# EAGLE schematic RU-PCBA-2X2-001-03 (EAGLE 9.7.0), part 5 of 5
## Sheet 13 of 17: Row 13
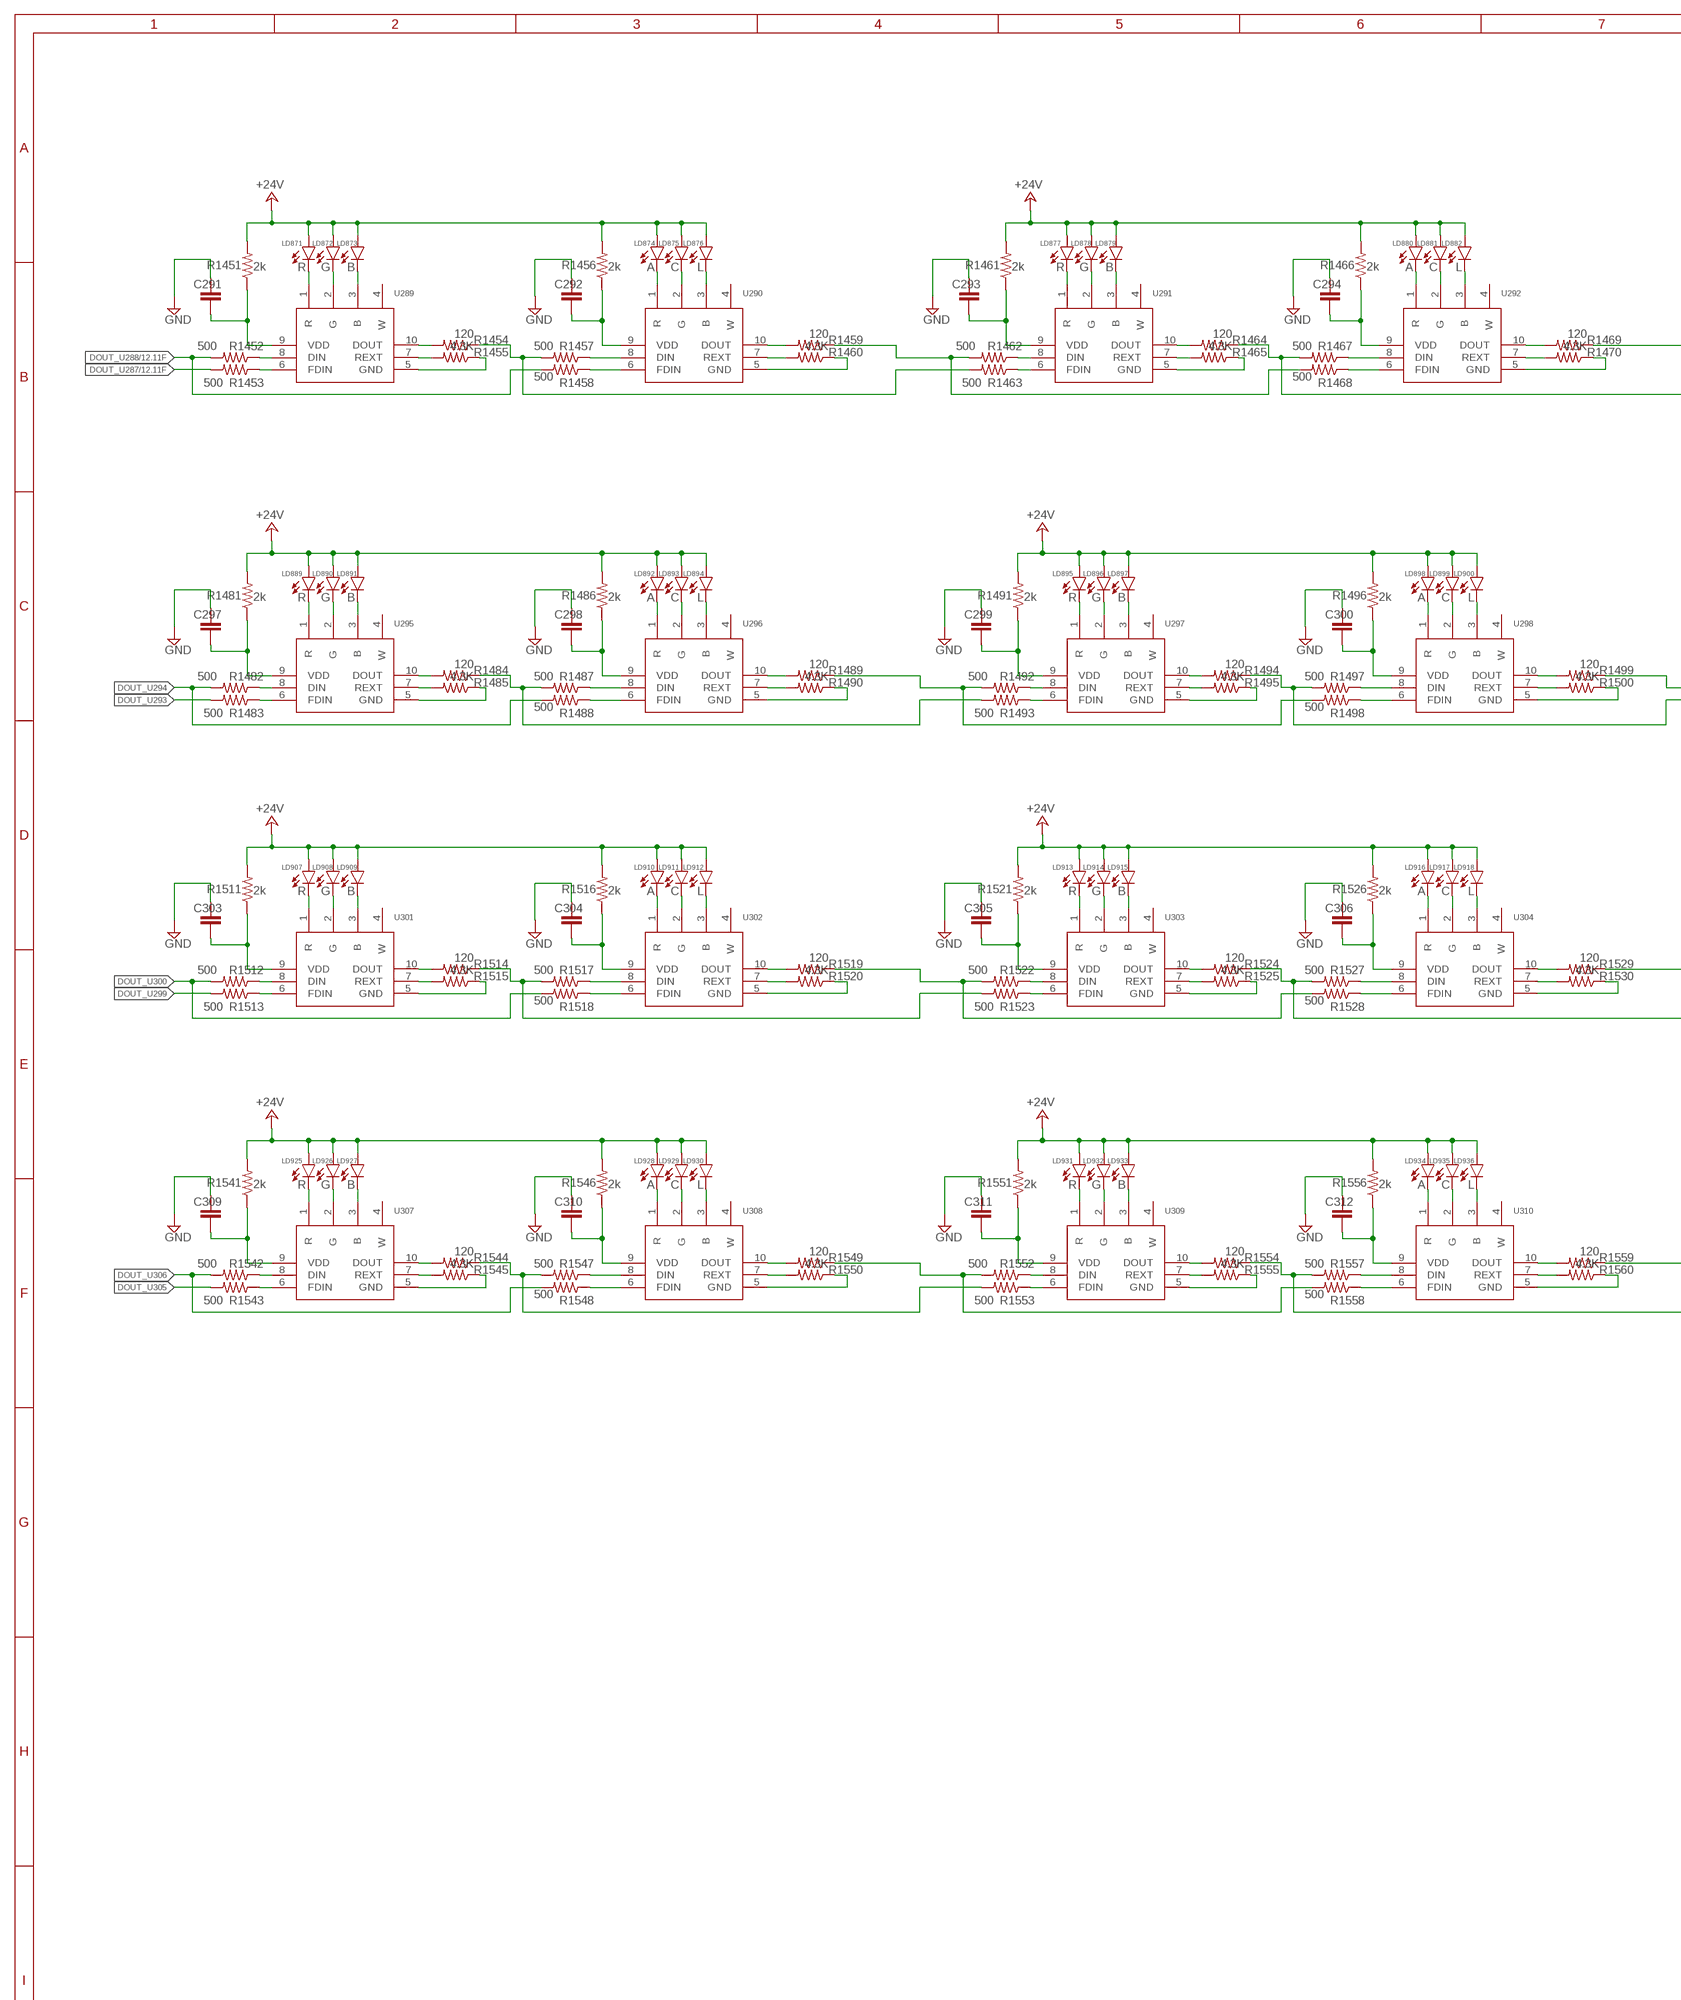
[diagram p24: schematic, sheet 13, part 1 of 2]
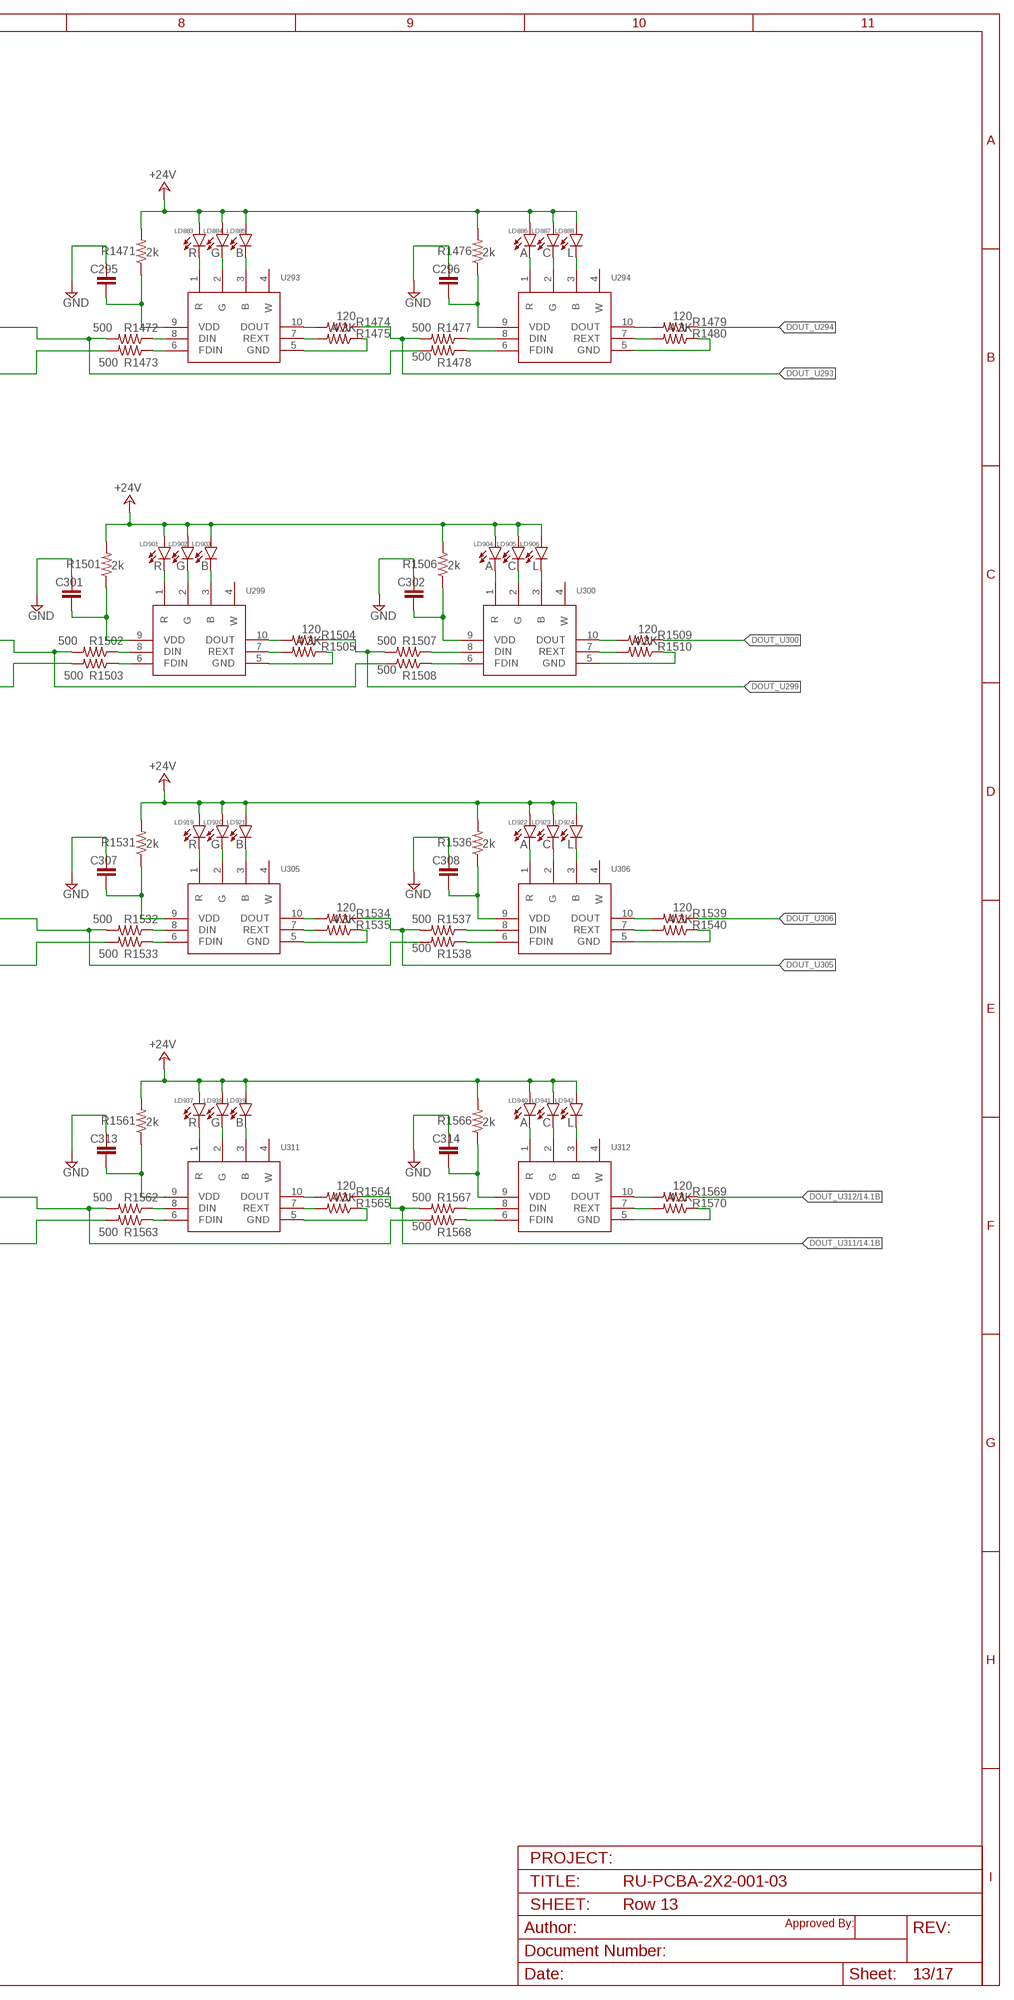
[diagram p25: schematic, sheet 13, part 2 of 2]

### Parts
C291  C-EUC1206  [C1206]
C292  C-EUC1206  [C1206]
C293  C-EUC1206  [C1206]
C294  C-EUC1206  [C1206]
C295  C-EUC1206  [C1206]
C296  C-EUC1206  [C1206]
C297  C-EUC1206  [C1206]
C298  C-EUC1206  [C1206]
C299  C-EUC1206  [C1206]
C300  C-EUC1206  [C1206]
C301  C-EUC1206  [C1206]
C302  C-EUC1206  [C1206]
C303  C-EUC1206  [C1206]
C304  C-EUC1206  [C1206]
C305  C-EUC1206  [C1206]
C306  C-EUC1206  [C1206]
C307  C-EUC1206  [C1206]
C308  C-EUC1206  [C1206]
C309  C-EUC1206  [C1206]
C310  C-EUC1206  [C1206]
C311  C-EUC1206  [C1206]
C312  C-EUC1206  [C1206]
C313  C-EUC1206  [C1206]
C314  C-EUC1206  [C1206]
LD871  R  5050LED  [5050LED]
LD872  G  5050LED  [5050LED]
LD873  B  5050LED  [5050LED]
LD874  A  5050LED  [5050LED]
LD875  C  5050LED  [5050LED]
LD876  L  5050LED  [5050LED]
LD877  R  5050LED  [5050LED]
LD878  G  5050LED  [5050LED]
LD879  B  5050LED  [5050LED]
LD880  A  5050LED  [5050LED]
LD881  C  5050LED  [5050LED]
LD882  L  5050LED  [5050LED]
LD883  R  5050LED  [5050LED]
LD884  G  5050LED  [5050LED]
LD885  B  5050LED  [5050LED]
LD886  A  5050LED  [5050LED]
LD887  C  5050LED  [5050LED]
LD888  L  5050LED  [5050LED]
LD889  R  5050LED  [5050LED]
LD890  G  5050LED  [5050LED]
LD891  B  5050LED  [5050LED]
LD892  A  5050LED  [5050LED]
LD893  C  5050LED  [5050LED]
LD894  L  5050LED  [5050LED]
LD895  R  5050LED  [5050LED]
LD896  G  5050LED  [5050LED]
LD897  B  5050LED  [5050LED]
LD898  A  5050LED  [5050LED]
LD899  C  5050LED  [5050LED]
LD900  L  5050LED  [5050LED]
LD901  R  5050LED  [5050LED]
LD902  G  5050LED  [5050LED]
LD903  B  5050LED  [5050LED]
LD904  A  5050LED  [5050LED]
LD905  C  5050LED  [5050LED]
LD906  L  5050LED  [5050LED]
LD907  R  5050LED  [5050LED]
LD908  G  5050LED  [5050LED]
LD909  B  5050LED  [5050LED]
LD910  A  5050LED  [5050LED]
LD911  C  5050LED  [5050LED]
LD912  L  5050LED  [5050LED]
LD913  R  5050LED  [5050LED]
LD914  G  5050LED  [5050LED]
LD915  B  5050LED  [5050LED]
LD916  A  5050LED  [5050LED]
LD917  C  5050LED  [5050LED]
LD918  L  5050LED  [5050LED]
LD919  R  5050LED  [5050LED]
LD920  G  5050LED  [5050LED]
LD921  B  5050LED  [5050LED]
LD922  A  5050LED  [5050LED]
LD923  C  5050LED  [5050LED]
LD924  L  5050LED  [5050LED]
LD925  R  5050LED  [5050LED]
LD926  G  5050LED  [5050LED]
LD927  B  5050LED  [5050LED]
LD928  A  5050LED  [5050LED]
LD929  C  5050LED  [5050LED]
LD930  L  5050LED  [5050LED]
LD931  R  5050LED  [5050LED]
LD932  G  5050LED  [5050LED]
LD933  B  5050LED  [5050LED]
LD934  A  5050LED  [5050LED]
LD935  C  5050LED  [5050LED]
LD936  L  5050LED  [5050LED]
LD937  R  5050LED  [5050LED]
LD938  G  5050LED  [5050LED]
LD939  B  5050LED  [5050LED]
LD940  A  5050LED  [5050LED]
LD941  C  5050LED  [5050LED]
LD942  L  5050LED  [5050LED]
R1451  2k  R-US_R1206  [R1206]
R1452  500  R-US_R0805  [R0805]
R1453  500  R-US_R0805  [R0805]
R1454  120  R-US_R0805  [R0805]
R1455  4.3K  R-US_R0805  [R0805]
R1456  2k  R-US_R1206  [R1206]
R1457  500  R-US_R0805  [R0805]
R1458  500  R-US_R0805  [R0805]
R1459  120  R-US_R0805  [R0805]
R1460  4.3K  R-US_R0805  [R0805]
R1461  2k  R-US_R1206  [R1206]
R1462  500  R-US_R0805  [R0805]
R1463  500  R-US_R0805  [R0805]
R1464  120  R-US_R0805  [R0805]
R1465  4.3K  R-US_R0805  [R0805]
R1466  2k  R-US_R1206  [R1206]
R1467  500  R-US_R0805  [R0805]
R1468  500  R-US_R0805  [R0805]
R1469  120  R-US_R0805  [R0805]
R1470  4.3K  R-US_R0805  [R0805]
R1471  2k  R-US_R1206  [R1206]
R1472  500  R-US_R0805  [R0805]
R1473  500  R-US_R0805  [R0805]
R1474  120  R-US_R0805  [R0805]
R1475  4.3K  R-US_R0805  [R0805]
R1476  2k  R-US_R1206  [R1206]
R1477  500  R-US_R0805  [R0805]
R1478  500  R-US_R0805  [R0805]
R1479  120  R-US_R0805  [R0805]
R1480  4.3K  R-US_R0805  [R0805]
R1481  2k  R-US_R1206  [R1206]
R1482  500  R-US_R0805  [R0805]
R1483  500  R-US_R0805  [R0805]
R1484  120  R-US_R0805  [R0805]
R1485  4.3K  R-US_R0805  [R0805]
R1486  2k  R-US_R1206  [R1206]
R1487  500  R-US_R0805  [R0805]
R1488  500  R-US_R0805  [R0805]
R1489  120  R-US_R0805  [R0805]
R1490  4.3K  R-US_R0805  [R0805]
R1491  2k  R-US_R1206  [R1206]
R1492  500  R-US_R0805  [R0805]
R1493  500  R-US_R0805  [R0805]
R1494  120  R-US_R0805  [R0805]
R1495  4.3K  R-US_R0805  [R0805]
R1496  2k  R-US_R1206  [R1206]
R1497  500  R-US_R0805  [R0805]
R1498  500  R-US_R0805  [R0805]
R1499  120  R-US_R0805  [R0805]
R1500  4.3K  R-US_R0805  [R0805]
R1501  2k  R-US_R1206  [R1206]
R1502  500  R-US_R0805  [R0805]
R1503  500  R-US_R0805  [R0805]
R1504  120  R-US_R0805  [R0805]
R1505  4.3K  R-US_R0805  [R0805]
R1506  2k  R-US_R1206  [R1206]
R1507  500  R-US_R0805  [R0805]
R1508  500  R-US_R0805  [R0805]
R1509  120  R-US_R0805  [R0805]
R1510  4.3K  R-US_R0805  [R0805]
R1511  2k  R-US_R1206  [R1206]
R1512  500  R-US_R0805  [R0805]
R1513  500  R-US_R0805  [R0805]
R1514  120  R-US_R0805  [R0805]
R1515  4.3K  R-US_R0805  [R0805]
R1516  2k  R-US_R1206  [R1206]
R1517  500  R-US_R0805  [R0805]
R1518  500  R-US_R0805  [R0805]
R1519  120  R-US_R0805  [R0805]
R1520  4.3K  R-US_R0805  [R0805]
R1521  2k  R-US_R1206  [R1206]
R1522  500  R-US_R0805  [R0805]
R1523  500  R-US_R0805  [R0805]
R1524  120  R-US_R0805  [R0805]
R1525  4.3K  R-US_R0805  [R0805]
R1526  2k  R-US_R1206  [R1206]
R1527  500  R-US_R0805  [R0805]
R1528  500  R-US_R0805  [R0805]
R1529  120  R-US_R0805  [R0805]
R1530  4.3K  R-US_R0805  [R0805]
R1531  2k  R-US_R1206  [R1206]
R1532  500  R-US_R0805  [R0805]
R1533  500  R-US_R0805  [R0805]
R1534  120  R-US_R0805  [R0805]
R1535  4.3K  R-US_R0805  [R0805]
R1536  2k  R-US_R1206  [R1206]
R1537  500  R-US_R0805  [R0805]
R1538  500  R-US_R0805  [R0805]
R1539  120  R-US_R0805  [R0805]
R1540  4.3K  R-US_R0805  [R0805]
R1541  2k  R-US_R1206  [R1206]
R1542  500  R-US_R0805  [R0805]
R1543  500  R-US_R0805  [R0805]
R1544  120  R-US_R0805  [R0805]
R1545  4.3K  R-US_R0805  [R0805]
R1546  2k  R-US_R1206  [R1206]
R1547  500  R-US_R0805  [R0805]
R1548  500  R-US_R0805  [R0805]
R1549  120  R-US_R0805  [R0805]
R1550  4.3K  R-US_R0805  [R0805]
R1551  2k  R-US_R1206  [R1206]
R1552  500  R-US_R0805  [R0805]
R1553  500  R-US_R0805  [R0805]
R1554  120  R-US_R0805  [R0805]
R1555  4.3K  R-US_R0805  [R0805]
R1556  2k  R-US_R1206  [R1206]
R1557  500  R-US_R0805  [R0805]
R1558  500  R-US_R0805  [R0805]
R1559  120  R-US_R0805  [R0805]
R1560  4.3K  R-US_R0805  [R0805]
R1561  2k  R-US_R1206  [R1206]
R1562  500  R-US_R0805  [R0805]
R1563  500  R-US_R0805  [R0805]
R1564  120  R-US_R0805  [R0805]
R1565  4.3K  R-US_R0805  [R0805]
R1566  2k  R-US_R1206  [R1206]
R1567  500  R-US_R0805  [R0805]
R1568  500  R-US_R0805  [R0805]
R1569  120  R-US_R0805  [R0805]
R1570  4.3K  R-US_R0805  [R0805]
U289  UCS7604  [SOP100P600X175-10N]
U290  UCS7604  [SOP100P600X175-10N]
U291  UCS7604  [SOP100P600X175-10N]
U292  UCS7604  [SOP100P600X175-10N]
U293  UCS7604  [SOP100P600X175-10N]
U294  UCS7604  [SOP100P600X175-10N]
U295  UCS7604  [SOP100P600X175-10N]
U296  UCS7604  [SOP100P600X175-10N]
U297  UCS7604  [SOP100P600X175-10N]
U298  UCS7604  [SOP100P600X175-10N]
U299  UCS7604  [SOP100P600X175-10N]
U300  UCS7604  [SOP100P600X175-10N]
U301  UCS7604  [SOP100P600X175-10N]
U302  UCS7604  [SOP100P600X175-10N]
U303  UCS7604  [SOP100P600X175-10N]
U304  UCS7604  [SOP100P600X175-10N]
U305  UCS7604  [SOP100P600X175-10N]
U306  UCS7604  [SOP100P600X175-10N]
U307  UCS7604  [SOP100P600X175-10N]
U308  UCS7604  [SOP100P600X175-10N]
U309  UCS7604  [SOP100P600X175-10N]
U310  UCS7604  [SOP100P600X175-10N]
U311  UCS7604  [SOP100P600X175-10N]
U312  UCS7604  [SOP100P600X175-10N]

### Nets
+24V: LD871.A LD872.A LD873.A LD874.A LD875.A LD876.A LD877.A LD878.A LD879.A LD880.A LD881.A LD882.A LD883.A LD884.A LD885.A LD886.A LD887.A LD888.A LD889.A LD890.A LD891.A LD892.A LD893.A LD894.A LD895.A LD896.A LD897.A LD898.A LD899.A LD900.A LD901.A LD902.A LD903.A LD904.A LD905.A LD906.A LD907.A LD908.A LD909.A LD910.A LD911.A LD912.A LD913.A LD914.A LD915.A LD916.A LD917.A LD918.A LD919.A LD920.A LD921.A LD922.A LD923.A LD924.A LD925.A LD926.A LD927.A LD928.A LD929.A LD930.A LD931.A LD932.A LD933.A LD934.A LD935.A LD936.A LD937.A LD938.A LD939.A LD940.A LD941.A LD942.A R1451.2 R1456.2 R1461.2 R1466.2 R1471.2 R1476.2 R1481.2 R1486.2 R1491.2 R1496.2 R1501.2 R1506.2 R1511.2 R1516.2 R1521.2 R1526.2 R1531.2 R1536.2 R1541.2 R1546.2 R1551.2 R1556.2 R1561.2 R1566.2 ; also sheet 1,2,3,4,5,6,7,8,9,10,11,12,14
DOUT_U287: R1453.2 ; also sheet 12
DOUT_U288: R1452.2 R1458.2 ; also sheet 12
DOUT_U293: R1474.1 R1477.2 R1483.2
DOUT_U294: R1479.1 R1482.2 R1488.2
DOUT_U299: R1504.1 R1507.2 R1513.2
DOUT_U300: R1509.1 R1512.2 R1518.2
DOUT_U305: R1534.1 R1537.2 R1543.2
DOUT_U306: R1539.1 R1542.2 R1548.2
DOUT_U311: R1564.1 R1567.2 ; also sheet 14
DOUT_U312: R1569.1 ; also sheet 14
GND: C291.2 C292.2 C293.2 C294.2 C295.2 C296.2 C297.2 C298.2 C299.2 C300.2 C301.2 C302.2 C303.2 C304.2 C305.2 C306.2 C307.2 C308.2 C309.2 C310.2 C311.2 C312.2 C313.2 C314.2 R1455.1 R1460.1 R1465.1 R1470.1 R1475.1 R1480.1 R1485.1 R1490.1 R1495.1 R1500.1 R1505.1 R1510.1 R1515.1 R1520.1 R1525.1 R1530.1 R1535.1 R1540.1 R1545.1 R1550.1 R1555.1 R1560.1 R1565.1 R1570.1 U289.5(GND) U290.5(GND) U291.5(GND) U292.5(GND) U293.5(GND) U294.5(GND) U295.5(GND) U296.5(GND) U297.5(GND) U298.5(GND) U299.5(GND) U300.5(GND) U301.5(GND) U302.5(GND) U303.5(GND) U304.5(GND) U305.5(GND) U306.5(GND) U307.5(GND) U308.5(GND) U309.5(GND) U310.5(GND) U311.5(GND) U312.5(GND) ; also sheet 1,2,3,4,5,6,7,8,9,10,11,12,14
N$2897: C291.1 R1451.1 U289.9(VDD)
N$2898: LD871.K(C) U289.1(R)
N$2899: LD872.K(C) U289.2(G)
N$2900: LD873.K(C) U289.3(B)
N$2901: R1452.1 U289.8(DIN)
N$2902: R1453.1 U289.6(FDIN)
N$2903: R1454.2 U289.10(DOUT)
N$2904: R1455.2 U289.7(REXT)
N$2905: LD874.K(C) U290.1(R)
N$2906: LD875.K(C) U290.2(G)
N$2907: LD876.K(C) U290.3(B)
N$2908: C292.1 R1456.1 U290.9(VDD)
N$2909: R1457.1 U290.8(DIN)
N$2910: R1454.1 R1457.2 R1463.2
N$2911: R1458.1 U290.6(FDIN)
N$2914: R1459.2 U290.10(DOUT)
N$2915: R1460.2 U290.7(REXT)
N$2916: R1459.1 R1462.2 R1468.2
N$2917: C293.1 R1461.1 U291.9(VDD)
N$2918: LD877.K(C) U291.1(R)
N$2919: LD878.K(C) U291.2(G)
N$2920: LD879.K(C) U291.3(B)
N$2921: R1462.1 U291.8(DIN)
N$2922: R1463.1 U291.6(FDIN)
N$2923: R1464.2 U291.10(DOUT)
N$2924: R1465.2 U291.7(REXT)
N$2925: LD880.K(C) U292.1(R)
N$2926: LD881.K(C) U292.2(G)
N$2927: LD882.K(C) U292.3(B)
N$2928: C294.1 R1466.1 U292.9(VDD)
N$2929: R1467.1 U292.8(DIN)
N$2930: R1464.1 R1467.2 R1473.2
N$2931: R1468.1 U292.6(FDIN)
N$2934: R1469.2 U292.10(DOUT)
N$2935: R1470.2 U292.7(REXT)
N$2936: R1469.1 R1472.2 R1478.2
N$2937: C295.1 R1471.1 U293.9(VDD)
N$2938: LD883.K(C) U293.1(R)
N$2939: LD884.K(C) U293.2(G)
N$2940: LD885.K(C) U293.3(B)
N$2941: R1472.1 U293.8(DIN)
N$2942: R1473.1 U293.6(FDIN)
N$2943: R1474.2 U293.10(DOUT)
N$2944: R1475.2 U293.7(REXT)
N$2945: LD886.K(C) U294.1(R)
N$2946: LD887.K(C) U294.2(G)
N$2947: LD888.K(C) U294.3(B)
N$2948: C296.1 R1476.1 U294.9(VDD)
N$2949: R1477.1 U294.8(DIN)
N$2951: R1478.1 U294.6(FDIN)
N$2954: R1479.2 U294.10(DOUT)
N$2955: R1480.2 U294.7(REXT)
N$2957: C297.1 R1481.1 U295.9(VDD)
N$2958: LD889.K(C) U295.1(R)
N$2959: LD890.K(C) U295.2(G)
N$2960: LD891.K(C) U295.3(B)
N$2961: R1482.1 U295.8(DIN)
N$2962: R1483.1 U295.6(FDIN)
N$2963: R1484.2 U295.10(DOUT)
N$2964: R1485.2 U295.7(REXT)
N$2965: LD892.K(C) U296.1(R)
N$2966: LD893.K(C) U296.2(G)
N$2967: LD894.K(C) U296.3(B)
N$2968: C298.1 R1486.1 U296.9(VDD)
N$2969: R1487.1 U296.8(DIN)
N$2970: R1484.1 R1487.2 R1493.2
N$2971: R1488.1 U296.6(FDIN)
N$2974: R1489.2 U296.10(DOUT)
N$2975: R1490.2 U296.7(REXT)
N$2976: R1489.1 R1492.2 R1498.2
N$2977: C299.1 R1491.1 U297.9(VDD)
N$2978: LD895.K(C) U297.1(R)
N$2979: LD896.K(C) U297.2(G)
N$2980: LD897.K(C) U297.3(B)
N$2981: R1492.1 U297.8(DIN)
N$2982: R1493.1 U297.6(FDIN)
N$2983: R1494.2 U297.10(DOUT)
N$2984: R1495.2 U297.7(REXT)
N$2985: LD898.K(C) U298.1(R)
N$2986: LD899.K(C) U298.2(G)
N$2987: LD900.K(C) U298.3(B)
N$2988: C300.1 R1496.1 U298.9(VDD)
N$2989: R1497.1 U298.8(DIN)
N$2990: R1494.1 R1497.2 R1503.2
N$2991: R1498.1 U298.6(FDIN)
N$2994: R1499.2 U298.10(DOUT)
N$2995: R1500.2 U298.7(REXT)
N$2996: R1499.1 R1502.2 R1508.2
N$2997: C301.1 R1501.1 U299.9(VDD)
N$2998: LD901.K(C) U299.1(R)
N$2999: LD902.K(C) U299.2(G)
N$3000: LD903.K(C) U299.3(B)
N$3001: R1502.1 U299.8(DIN)
N$3002: R1503.1 U299.6(FDIN)
N$3003: R1504.2 U299.10(DOUT)
N$3004: R1505.2 U299.7(REXT)
N$3005: LD904.K(C) U300.1(R)
N$3006: LD905.K(C) U300.2(G)
N$3007: LD906.K(C) U300.3(B)
N$3008: C302.1 R1506.1 U300.9(VDD)
N$3009: R1507.1 U300.8(DIN)
N$3011: R1508.1 U300.6(FDIN)
N$3014: R1509.2 U300.10(DOUT)
N$3015: R1510.2 U300.7(REXT)
N$3017: C303.1 R1511.1 U301.9(VDD)
N$3018: LD907.K(C) U301.1(R)
N$3019: LD908.K(C) U301.2(G)
N$3020: LD909.K(C) U301.3(B)
N$3021: R1512.1 U301.8(DIN)
N$3022: R1513.1 U301.6(FDIN)
N$3023: R1514.2 U301.10(DOUT)
N$3024: R1515.2 U301.7(REXT)
N$3025: LD910.K(C) U302.1(R)
N$3026: LD911.K(C) U302.2(G)
N$3027: LD912.K(C) U302.3(B)
N$3028: C304.1 R1516.1 U302.9(VDD)
N$3029: R1517.1 U302.8(DIN)
N$3030: R1514.1 R1517.2 R1523.2
N$3031: R1518.1 U302.6(FDIN)
N$3034: R1519.2 U302.10(DOUT)
N$3035: R1520.2 U302.7(REXT)
N$3036: R1519.1 R1522.2 R1528.2
N$3037: C305.1 R1521.1 U303.9(VDD)
N$3038: LD913.K(C) U303.1(R)
N$3039: LD914.K(C) U303.2(G)
N$3040: LD915.K(C) U303.3(B)
N$3041: R1522.1 U303.8(DIN)
N$3042: R1523.1 U303.6(FDIN)
N$3043: R1524.2 U303.10(DOUT)
N$3044: R1525.2 U303.7(REXT)
N$3045: LD916.K(C) U304.1(R)
N$3046: LD917.K(C) U304.2(G)
N$3047: LD918.K(C) U304.3(B)
N$3048: C306.1 R1526.1 U304.9(VDD)
N$3049: R1527.1 U304.8(DIN)
N$3050: R1524.1 R1527.2 R1533.2
N$3051: R1528.1 U304.6(FDIN)
N$3054: R1529.2 U304.10(DOUT)
N$3055: R1530.2 U304.7(REXT)
N$3056: R1529.1 R1532.2 R1538.2
N$3057: C307.1 R1531.1 U305.9(VDD)
N$3058: LD919.K(C) U305.1(R)
N$3059: LD920.K(C) U305.2(G)
N$3060: LD921.K(C) U305.3(B)
N$3061: R1532.1 U305.8(DIN)
N$3062: R1533.1 U305.6(FDIN)
N$3063: R1534.2 U305.10(DOUT)
N$3064: R1535.2 U305.7(REXT)
N$3065: LD922.K(C) U306.1(R)
N$3066: LD923.K(C) U306.2(G)
N$3067: LD924.K(C) U306.3(B)
N$3068: C308.1 R1536.1 U306.9(VDD)
N$3069: R1537.1 U306.8(DIN)
N$3071: R1538.1 U306.6(FDIN)
N$3074: R1539.2 U306.10(DOUT)
N$3075: R1540.2 U306.7(REXT)
N$3077: C309.1 R1541.1 U307.9(VDD)
N$3078: LD925.K(C) U307.1(R)
N$3079: LD926.K(C) U307.2(G)
N$3080: LD927.K(C) U307.3(B)
N$3081: R1542.1 U307.8(DIN)
N$3082: R1543.1 U307.6(FDIN)
N$3083: R1544.2 U307.10(DOUT)
N$3084: R1545.2 U307.7(REXT)
N$3085: LD928.K(C) U308.1(R)
N$3086: LD929.K(C) U308.2(G)
N$3087: LD930.K(C) U308.3(B)
N$3088: C310.1 R1546.1 U308.9(VDD)
N$3089: R1547.1 U308.8(DIN)
N$3090: R1544.1 R1547.2 R1553.2
N$3091: R1548.1 U308.6(FDIN)
N$3094: R1549.2 U308.10(DOUT)
N$3095: R1550.2 U308.7(REXT)
N$3096: R1549.1 R1552.2 R1558.2
N$3097: C311.1 R1551.1 U309.9(VDD)
N$3098: LD931.K(C) U309.1(R)
N$3099: LD932.K(C) U309.2(G)
N$3100: LD933.K(C) U309.3(B)
N$3101: R1552.1 U309.8(DIN)
N$3102: R1553.1 U309.6(FDIN)
N$3103: R1554.2 U309.10(DOUT)
N$3104: R1555.2 U309.7(REXT)
N$3105: LD934.K(C) U310.1(R)
N$3106: LD935.K(C) U310.2(G)
N$3107: LD936.K(C) U310.3(B)
N$3108: C312.1 R1556.1 U310.9(VDD)
N$3109: R1557.1 U310.8(DIN)
N$3110: R1554.1 R1557.2 R1563.2
N$3111: R1558.1 U310.6(FDIN)
N$3114: R1559.2 U310.10(DOUT)
N$3115: R1560.2 U310.7(REXT)
N$3116: R1559.1 R1562.2 R1568.2
N$3117: C313.1 R1561.1 U311.9(VDD)
N$3118: LD937.K(C) U311.1(R)
N$3119: LD938.K(C) U311.2(G)
N$3120: LD939.K(C) U311.3(B)
N$3121: R1562.1 U311.8(DIN)
N$3122: R1563.1 U311.6(FDIN)
N$3123: R1564.2 U311.10(DOUT)
N$3124: R1565.2 U311.7(REXT)
N$3125: LD940.K(C) U312.1(R)
N$3126: LD941.K(C) U312.2(G)
N$3127: LD942.K(C) U312.3(B)
N$3128: C314.1 R1566.1 U312.9(VDD)
N$3129: R1567.1 U312.8(DIN)
N$3131: R1568.1 U312.6(FDIN)
N$3134: R1569.2 U312.10(DOUT)
N$3135: R1570.2 U312.7(REXT)
Unconnected: U289.4(W) U290.4(W) U291.4(W) U292.4(W) U293.4(W) U294.4(W) U295.4(W) U296.4(W) U297.4(W) U298.4(W) U299.4(W) U300.4(W) U301.4(W) U302.4(W) U303.4(W) U304.4(W) U305.4(W) U306.4(W) U307.4(W) U308.4(W) U309.4(W) U310.4(W) U311.4(W) U312.4(W)

## Sheet 14 of 17: Row 14
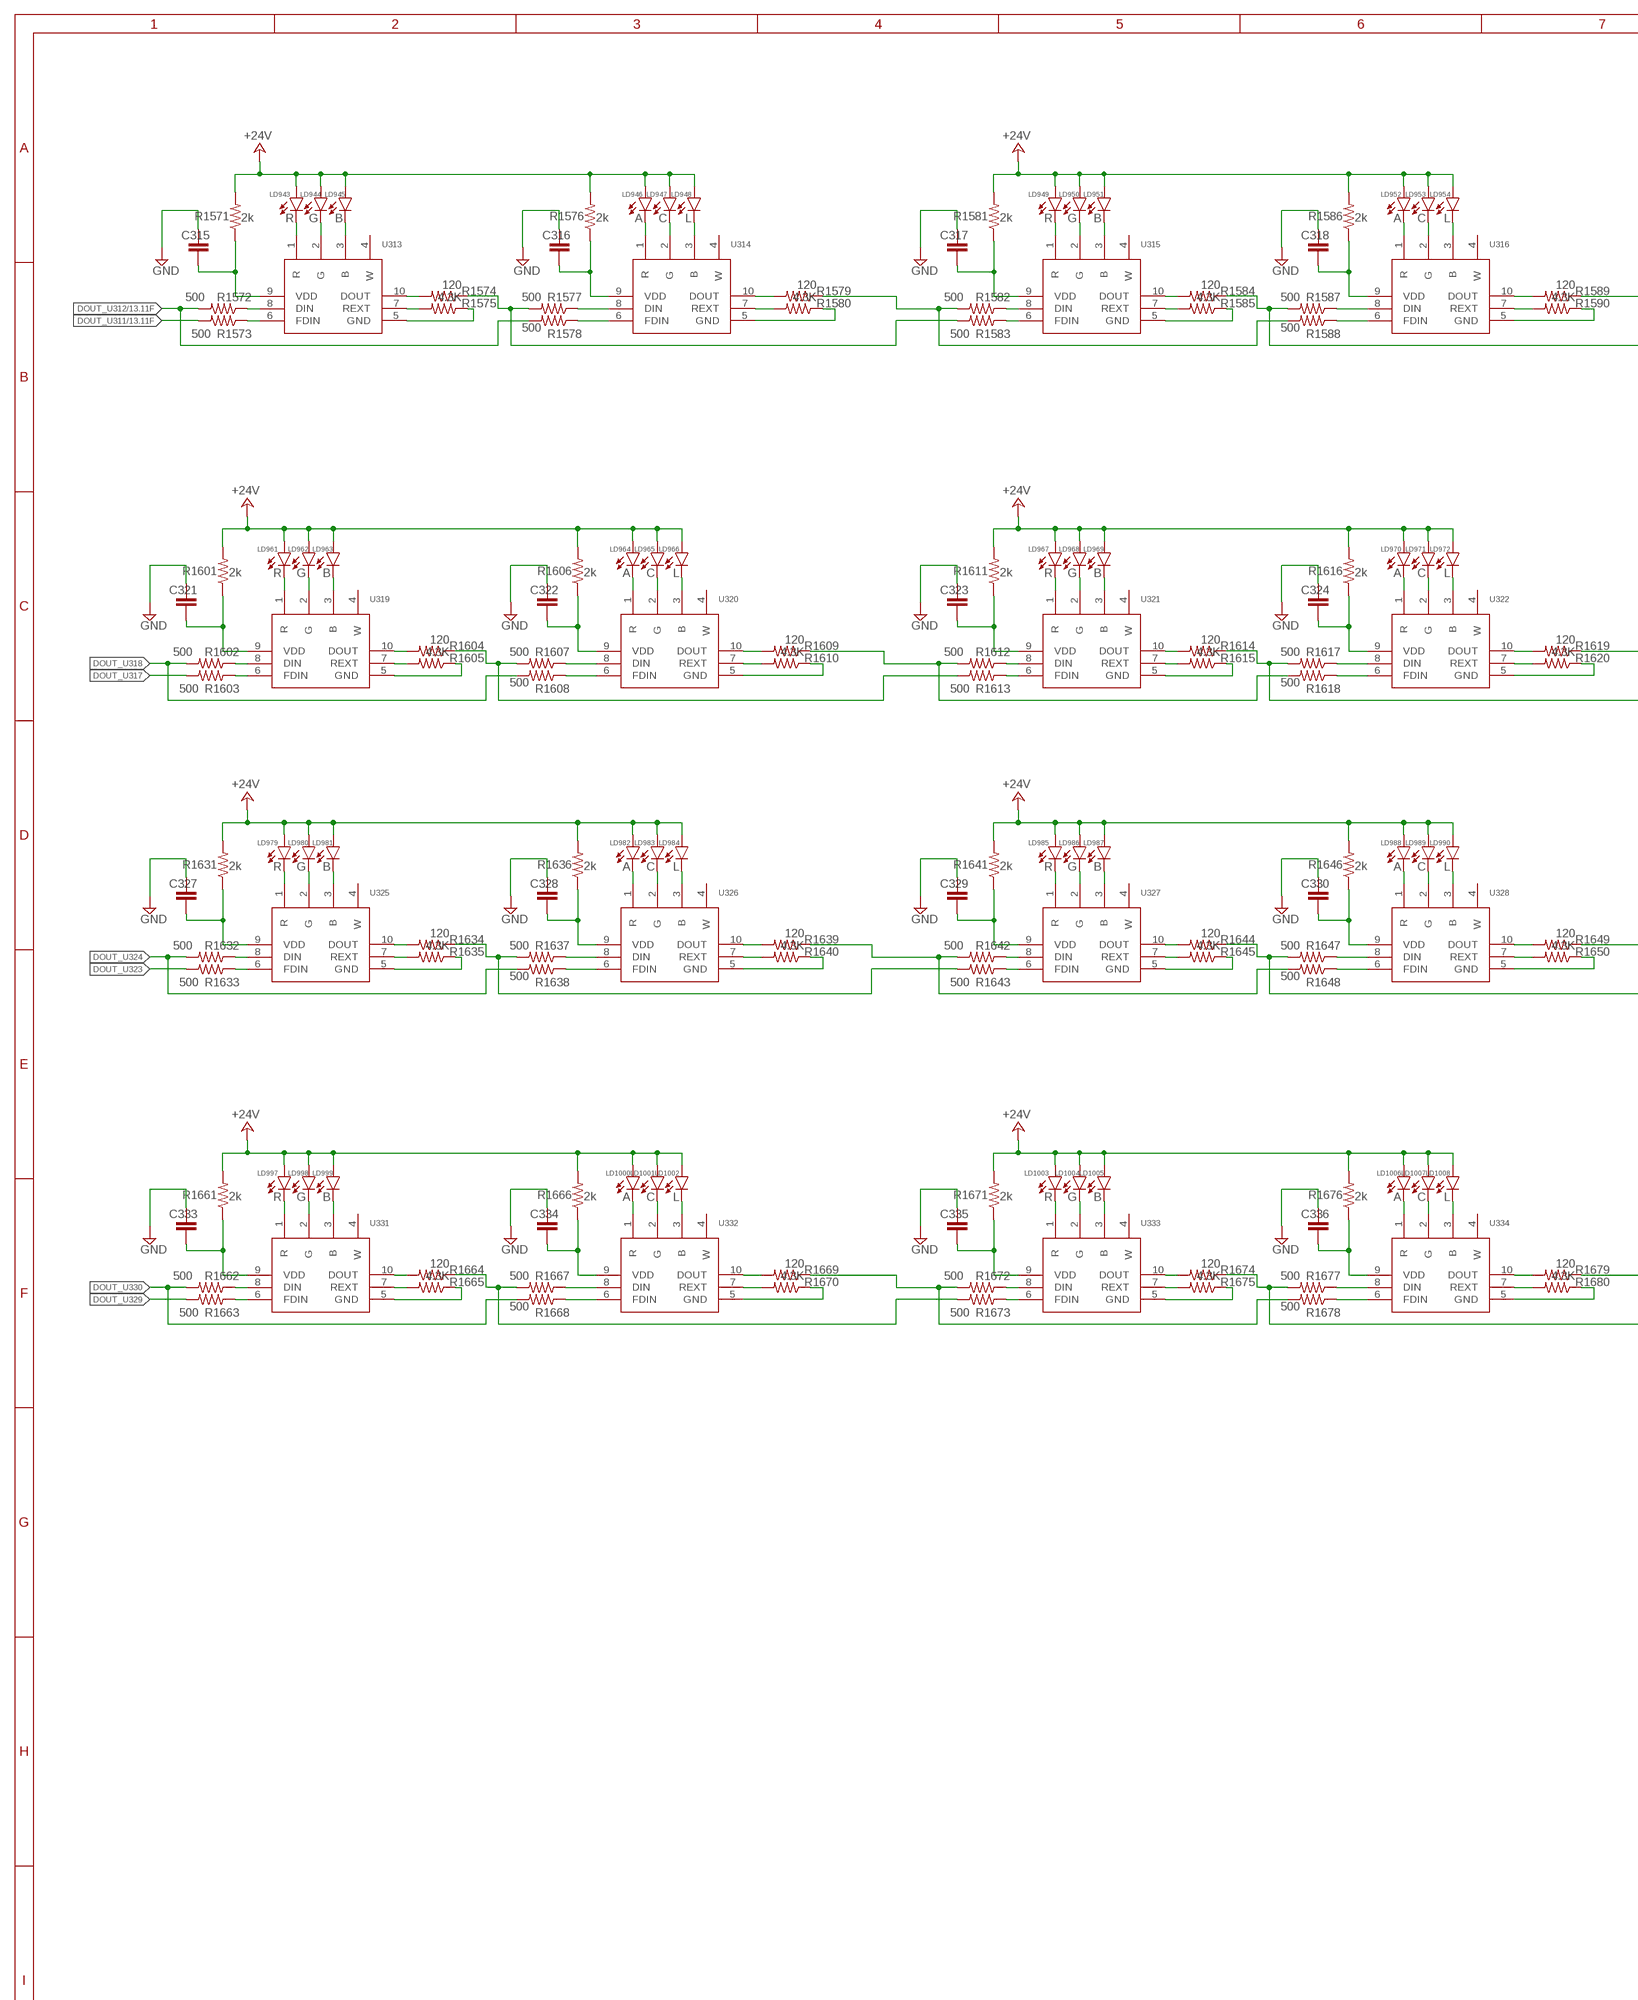
[diagram p26: schematic, sheet 14, part 1 of 2]
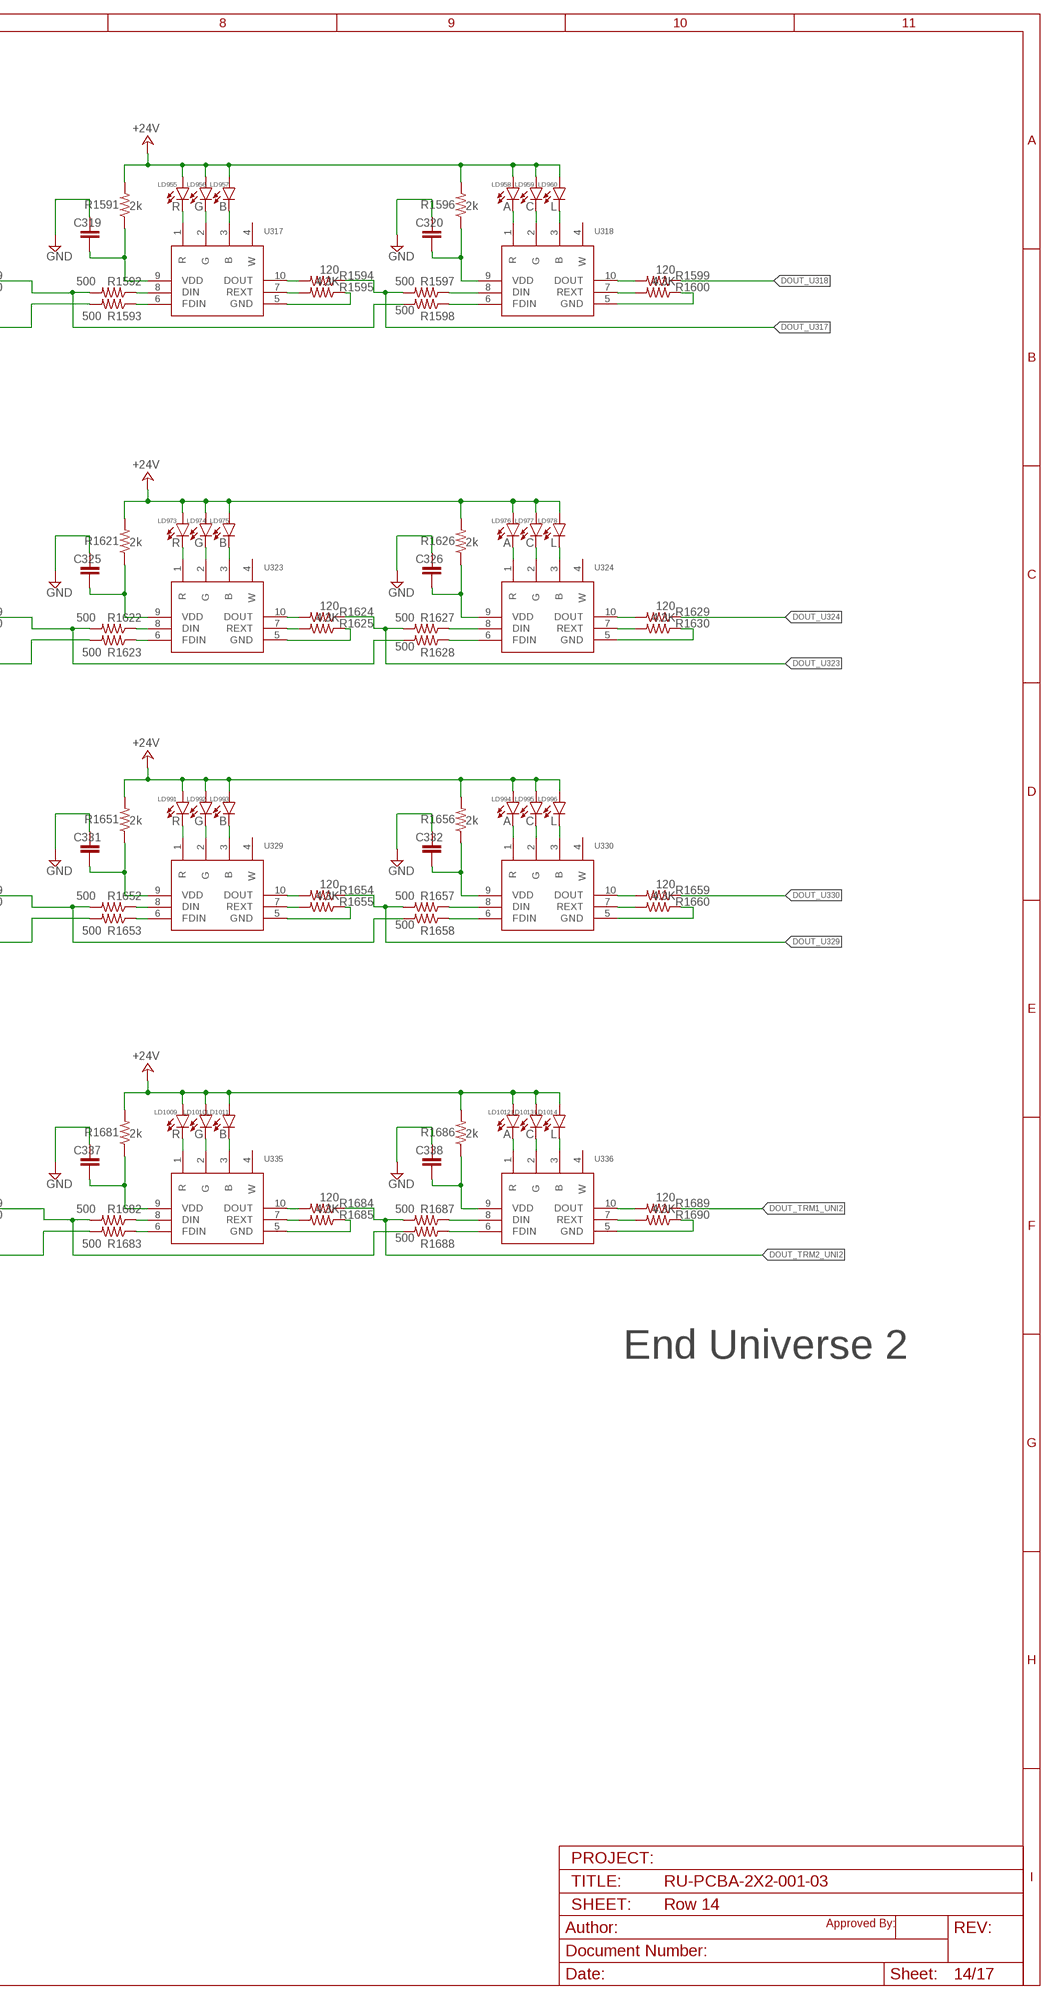
[diagram p27: schematic, sheet 14, part 2 of 2]

### Parts
C315  C-EUC1206  [C1206]
C316  C-EUC1206  [C1206]
C317  C-EUC1206  [C1206]
C318  C-EUC1206  [C1206]
C319  C-EUC1206  [C1206]
C320  C-EUC1206  [C1206]
C321  C-EUC1206  [C1206]
C322  C-EUC1206  [C1206]
C323  C-EUC1206  [C1206]
C324  C-EUC1206  [C1206]
C325  C-EUC1206  [C1206]
C326  C-EUC1206  [C1206]
C327  C-EUC1206  [C1206]
C328  C-EUC1206  [C1206]
C329  C-EUC1206  [C1206]
C330  C-EUC1206  [C1206]
C331  C-EUC1206  [C1206]
C332  C-EUC1206  [C1206]
C333  C-EUC1206  [C1206]
C334  C-EUC1206  [C1206]
C335  C-EUC1206  [C1206]
C336  C-EUC1206  [C1206]
C337  C-EUC1206  [C1206]
C338  C-EUC1206  [C1206]
LD943  R  5050LED  [5050LED]
LD944  G  5050LED  [5050LED]
LD945  B  5050LED  [5050LED]
LD946  A  5050LED  [5050LED]
LD947  C  5050LED  [5050LED]
LD948  L  5050LED  [5050LED]
LD949  R  5050LED  [5050LED]
LD950  G  5050LED  [5050LED]
LD951  B  5050LED  [5050LED]
LD952  A  5050LED  [5050LED]
LD953  C  5050LED  [5050LED]
LD954  L  5050LED  [5050LED]
LD955  R  5050LED  [5050LED]
LD956  G  5050LED  [5050LED]
LD957  B  5050LED  [5050LED]
LD958  A  5050LED  [5050LED]
LD959  C  5050LED  [5050LED]
LD960  L  5050LED  [5050LED]
LD961  R  5050LED  [5050LED]
LD962  G  5050LED  [5050LED]
LD963  B  5050LED  [5050LED]
LD964  A  5050LED  [5050LED]
LD965  C  5050LED  [5050LED]
LD966  L  5050LED  [5050LED]
LD967  R  5050LED  [5050LED]
LD968  G  5050LED  [5050LED]
LD969  B  5050LED  [5050LED]
LD970  A  5050LED  [5050LED]
LD971  C  5050LED  [5050LED]
LD972  L  5050LED  [5050LED]
LD973  R  5050LED  [5050LED]
LD974  G  5050LED  [5050LED]
LD975  B  5050LED  [5050LED]
LD976  A  5050LED  [5050LED]
LD977  C  5050LED  [5050LED]
LD978  L  5050LED  [5050LED]
LD979  R  5050LED  [5050LED]
LD980  G  5050LED  [5050LED]
LD981  B  5050LED  [5050LED]
LD982  A  5050LED  [5050LED]
LD983  C  5050LED  [5050LED]
LD984  L  5050LED  [5050LED]
LD985  R  5050LED  [5050LED]
LD986  G  5050LED  [5050LED]
LD987  B  5050LED  [5050LED]
LD988  A  5050LED  [5050LED]
LD989  C  5050LED  [5050LED]
LD990  L  5050LED  [5050LED]
LD991  R  5050LED  [5050LED]
LD992  G  5050LED  [5050LED]
LD993  B  5050LED  [5050LED]
LD994  A  5050LED  [5050LED]
LD995  C  5050LED  [5050LED]
LD996  L  5050LED  [5050LED]
LD997  R  5050LED  [5050LED]
LD998  G  5050LED  [5050LED]
LD999  B  5050LED  [5050LED]
LD1000  A  5050LED  [5050LED]
LD1001  C  5050LED  [5050LED]
LD1002  L  5050LED  [5050LED]
LD1003  R  5050LED  [5050LED]
LD1004  G  5050LED  [5050LED]
LD1005  B  5050LED  [5050LED]
LD1006  A  5050LED  [5050LED]
LD1007  C  5050LED  [5050LED]
LD1008  L  5050LED  [5050LED]
LD1009  R  5050LED  [5050LED]
LD1010  G  5050LED  [5050LED]
LD1011  B  5050LED  [5050LED]
LD1012  A  5050LED  [5050LED]
LD1013  C  5050LED  [5050LED]
LD1014  L  5050LED  [5050LED]
R1571  2k  R-US_R1206  [R1206]
R1572  500  R-US_R0805  [R0805]
R1573  500  R-US_R0805  [R0805]
R1574  120  R-US_R0805  [R0805]
R1575  4.3K  R-US_R0805  [R0805]
R1576  2k  R-US_R1206  [R1206]
R1577  500  R-US_R0805  [R0805]
R1578  500  R-US_R0805  [R0805]
R1579  120  R-US_R0805  [R0805]
R1580  4.3K  R-US_R0805  [R0805]
R1581  2k  R-US_R1206  [R1206]
R1582  500  R-US_R0805  [R0805]
R1583  500  R-US_R0805  [R0805]
R1584  120  R-US_R0805  [R0805]
R1585  4.3K  R-US_R0805  [R0805]
R1586  2k  R-US_R1206  [R1206]
R1587  500  R-US_R0805  [R0805]
R1588  500  R-US_R0805  [R0805]
R1589  120  R-US_R0805  [R0805]
R1590  4.3K  R-US_R0805  [R0805]
R1591  2k  R-US_R1206  [R1206]
R1592  500  R-US_R0805  [R0805]
R1593  500  R-US_R0805  [R0805]
R1594  120  R-US_R0805  [R0805]
R1595  4.3K  R-US_R0805  [R0805]
R1596  2k  R-US_R1206  [R1206]
R1597  500  R-US_R0805  [R0805]
R1598  500  R-US_R0805  [R0805]
R1599  120  R-US_R0805  [R0805]
R1600  4.3K  R-US_R0805  [R0805]
R1601  2k  R-US_R1206  [R1206]
R1602  500  R-US_R0805  [R0805]
R1603  500  R-US_R0805  [R0805]
R1604  120  R-US_R0805  [R0805]
R1605  4.3K  R-US_R0805  [R0805]
R1606  2k  R-US_R1206  [R1206]
R1607  500  R-US_R0805  [R0805]
R1608  500  R-US_R0805  [R0805]
R1609  120  R-US_R0805  [R0805]
R1610  4.3K  R-US_R0805  [R0805]
R1611  2k  R-US_R1206  [R1206]
R1612  500  R-US_R0805  [R0805]
R1613  500  R-US_R0805  [R0805]
R1614  120  R-US_R0805  [R0805]
R1615  4.3K  R-US_R0805  [R0805]
R1616  2k  R-US_R1206  [R1206]
R1617  500  R-US_R0805  [R0805]
R1618  500  R-US_R0805  [R0805]
R1619  120  R-US_R0805  [R0805]
R1620  4.3K  R-US_R0805  [R0805]
R1621  2k  R-US_R1206  [R1206]
R1622  500  R-US_R0805  [R0805]
R1623  500  R-US_R0805  [R0805]
R1624  120  R-US_R0805  [R0805]
R1625  4.3K  R-US_R0805  [R0805]
R1626  2k  R-US_R1206  [R1206]
R1627  500  R-US_R0805  [R0805]
R1628  500  R-US_R0805  [R0805]
R1629  120  R-US_R0805  [R0805]
R1630  4.3K  R-US_R0805  [R0805]
R1631  2k  R-US_R1206  [R1206]
R1632  500  R-US_R0805  [R0805]
R1633  500  R-US_R0805  [R0805]
R1634  120  R-US_R0805  [R0805]
R1635  4.3K  R-US_R0805  [R0805]
R1636  2k  R-US_R1206  [R1206]
R1637  500  R-US_R0805  [R0805]
R1638  500  R-US_R0805  [R0805]
R1639  120  R-US_R0805  [R0805]
R1640  4.3K  R-US_R0805  [R0805]
R1641  2k  R-US_R1206  [R1206]
R1642  500  R-US_R0805  [R0805]
R1643  500  R-US_R0805  [R0805]
R1644  120  R-US_R0805  [R0805]
R1645  4.3K  R-US_R0805  [R0805]
R1646  2k  R-US_R1206  [R1206]
R1647  500  R-US_R0805  [R0805]
R1648  500  R-US_R0805  [R0805]
R1649  120  R-US_R0805  [R0805]
R1650  4.3K  R-US_R0805  [R0805]
R1651  2k  R-US_R1206  [R1206]
R1652  500  R-US_R0805  [R0805]
R1653  500  R-US_R0805  [R0805]
R1654  120  R-US_R0805  [R0805]
R1655  4.3K  R-US_R0805  [R0805]
R1656  2k  R-US_R1206  [R1206]
R1657  500  R-US_R0805  [R0805]
R1658  500  R-US_R0805  [R0805]
R1659  120  R-US_R0805  [R0805]
R1660  4.3K  R-US_R0805  [R0805]
R1661  2k  R-US_R1206  [R1206]
R1662  500  R-US_R0805  [R0805]
R1663  500  R-US_R0805  [R0805]
R1664  120  R-US_R0805  [R0805]
R1665  4.3K  R-US_R0805  [R0805]
R1666  2k  R-US_R1206  [R1206]
R1667  500  R-US_R0805  [R0805]
R1668  500  R-US_R0805  [R0805]
R1669  120  R-US_R0805  [R0805]
R1670  4.3K  R-US_R0805  [R0805]
R1671  2k  R-US_R1206  [R1206]
R1672  500  R-US_R0805  [R0805]
R1673  500  R-US_R0805  [R0805]
R1674  120  R-US_R0805  [R0805]
R1675  4.3K  R-US_R0805  [R0805]
R1676  2k  R-US_R1206  [R1206]
R1677  500  R-US_R0805  [R0805]
R1678  500  R-US_R0805  [R0805]
R1679  120  R-US_R0805  [R0805]
R1680  4.3K  R-US_R0805  [R0805]
R1681  2k  R-US_R1206  [R1206]
R1682  500  R-US_R0805  [R0805]
R1683  500  R-US_R0805  [R0805]
R1684  120  R-US_R0805  [R0805]
R1685  4.3K  R-US_R0805  [R0805]
R1686  2k  R-US_R1206  [R1206]
R1687  500  R-US_R0805  [R0805]
R1688  500  R-US_R0805  [R0805]
R1689  120  R-US_R0805  [R0805]
R1690  4.3K  R-US_R0805  [R0805]
U313  UCS7604  [SOP100P600X175-10N]
U314  UCS7604  [SOP100P600X175-10N]
U315  UCS7604  [SOP100P600X175-10N]
U316  UCS7604  [SOP100P600X175-10N]
U317  UCS7604  [SOP100P600X175-10N]
U318  UCS7604  [SOP100P600X175-10N]
U319  UCS7604  [SOP100P600X175-10N]
U320  UCS7604  [SOP100P600X175-10N]
U321  UCS7604  [SOP100P600X175-10N]
U322  UCS7604  [SOP100P600X175-10N]
U323  UCS7604  [SOP100P600X175-10N]
U324  UCS7604  [SOP100P600X175-10N]
U325  UCS7604  [SOP100P600X175-10N]
U326  UCS7604  [SOP100P600X175-10N]
U327  UCS7604  [SOP100P600X175-10N]
U328  UCS7604  [SOP100P600X175-10N]
U329  UCS7604  [SOP100P600X175-10N]
U330  UCS7604  [SOP100P600X175-10N]
U331  UCS7604  [SOP100P600X175-10N]
U332  UCS7604  [SOP100P600X175-10N]
U333  UCS7604  [SOP100P600X175-10N]
U334  UCS7604  [SOP100P600X175-10N]
U335  UCS7604  [SOP100P600X175-10N]
U336  UCS7604  [SOP100P600X175-10N]

### Nets
+24V: LD943.A LD944.A LD945.A LD946.A LD947.A LD948.A LD949.A LD950.A LD951.A LD952.A LD953.A LD954.A LD955.A LD956.A LD957.A LD958.A LD959.A LD960.A LD961.A LD962.A LD963.A LD964.A LD965.A LD966.A LD967.A LD968.A LD969.A LD970.A LD971.A LD972.A LD973.A LD974.A LD975.A LD976.A LD977.A LD978.A LD979.A LD980.A LD981.A LD982.A LD983.A LD984.A LD985.A LD986.A LD987.A LD988.A LD989.A LD990.A LD991.A LD992.A LD993.A LD994.A LD995.A LD996.A LD997.A LD998.A LD999.A LD1000.A LD1001.A LD1002.A LD1003.A LD1004.A LD1005.A LD1006.A LD1007.A LD1008.A LD1009.A LD1010.A LD1011.A LD1012.A LD1013.A LD1014.A R1571.2 R1576.2 R1581.2 R1586.2 R1591.2 R1596.2 R1601.2 R1606.2 R1611.2 R1616.2 R1621.2 R1626.2 R1631.2 R1636.2 R1641.2 R1646.2 R1651.2 R1656.2 R1661.2 R1666.2 R1671.2 R1676.2 R1681.2 R1686.2 ; also sheet 1,2,3,4,5,6,7,8,9,10,11,12,13
DOUT_TRM1_UNI2: R1689.1
DOUT_TRM2_UNI2: R1684.1 R1687.2
DOUT_U311: R1573.2 ; also sheet 13
DOUT_U312: R1572.2 R1578.2 ; also sheet 13
DOUT_U317: R1594.1 R1597.2 R1603.2
DOUT_U318: R1599.1 R1602.2 R1608.2
DOUT_U323: R1624.1 R1627.2 R1633.2
DOUT_U324: R1629.1 R1632.2 R1638.2
DOUT_U329: R1654.1 R1657.2 R1663.2
DOUT_U330: R1659.1 R1662.2 R1668.2
GND: C315.2 C316.2 C317.2 C318.2 C319.2 C320.2 C321.2 C322.2 C323.2 C324.2 C325.2 C326.2 C327.2 C328.2 C329.2 C330.2 C331.2 C332.2 C333.2 C334.2 C335.2 C336.2 C337.2 C338.2 R1575.1 R1580.1 R1585.1 R1590.1 R1595.1 R1600.1 R1605.1 R1610.1 R1615.1 R1620.1 R1625.1 R1630.1 R1635.1 R1640.1 R1645.1 R1650.1 R1655.1 R1660.1 R1665.1 R1670.1 R1675.1 R1680.1 R1685.1 R1690.1 U313.5(GND) U314.5(GND) U315.5(GND) U316.5(GND) U317.5(GND) U318.5(GND) U319.5(GND) U320.5(GND) U321.5(GND) U322.5(GND) U323.5(GND) U324.5(GND) U325.5(GND) U326.5(GND) U327.5(GND) U328.5(GND) U329.5(GND) U330.5(GND) U331.5(GND) U332.5(GND) U333.5(GND) U334.5(GND) U335.5(GND) U336.5(GND) ; also sheet 1,2,3,4,5,6,7,8,9,10,11,12,13
N$3137: C315.1 R1571.1 U313.9(VDD)
N$3138: LD943.K(C) U313.1(R)
N$3139: LD944.K(C) U313.2(G)
N$3140: LD945.K(C) U313.3(B)
N$3141: R1572.1 U313.8(DIN)
N$3142: R1573.1 U313.6(FDIN)
N$3143: R1574.2 U313.10(DOUT)
N$3144: R1575.2 U313.7(REXT)
N$3145: LD946.K(C) U314.1(R)
N$3146: LD947.K(C) U314.2(G)
N$3147: LD948.K(C) U314.3(B)
N$3148: C316.1 R1576.1 U314.9(VDD)
N$3149: R1577.1 U314.8(DIN)
N$3150: R1574.1 R1577.2 R1583.2
N$3151: R1578.1 U314.6(FDIN)
N$3154: R1579.2 U314.10(DOUT)
N$3155: R1580.2 U314.7(REXT)
N$3157: C317.1 R1581.1 U315.9(VDD)
N$3158: LD949.K(C) U315.1(R)
N$3159: LD950.K(C) U315.2(G)
N$3160: LD951.K(C) U315.3(B)
N$3161: R1582.1 U315.8(DIN)
N$3162: R1583.1 U315.6(FDIN)
N$3163: R1584.2 U315.10(DOUT)
N$3164: R1585.2 U315.7(REXT)
N$3165: LD952.K(C) U316.1(R)
N$3166: LD953.K(C) U316.2(G)
N$3167: LD954.K(C) U316.3(B)
N$3168: C318.1 R1586.1 U316.9(VDD)
N$3169: R1587.1 U316.8(DIN)
N$3170: R1584.1 R1587.2 R1593.2
N$3171: R1588.1 U316.6(FDIN)
N$3172: R1579.1 R1582.2 R1588.2
N$3174: R1589.2 U316.10(DOUT)
N$3175: R1590.2 U316.7(REXT)
N$3176: R1589.1 R1592.2 R1598.2
N$3177: C319.1 R1591.1 U317.9(VDD)
N$3178: LD955.K(C) U317.1(R)
N$3179: LD956.K(C) U317.2(G)
N$3180: LD957.K(C) U317.3(B)
N$3181: R1592.1 U317.8(DIN)
N$3182: R1593.1 U317.6(FDIN)
N$3183: R1594.2 U317.10(DOUT)
N$3184: R1595.2 U317.7(REXT)
N$3185: LD958.K(C) U318.1(R)
N$3186: LD959.K(C) U318.2(G)
N$3187: LD960.K(C) U318.3(B)
N$3188: C320.1 R1596.1 U318.9(VDD)
N$3189: R1597.1 U318.8(DIN)
N$3191: R1598.1 U318.6(FDIN)
N$3194: R1599.2 U318.10(DOUT)
N$3195: R1600.2 U318.7(REXT)
N$3197: C321.1 R1601.1 U319.9(VDD)
N$3198: LD961.K(C) U319.1(R)
N$3199: LD962.K(C) U319.2(G)
N$3200: LD963.K(C) U319.3(B)
N$3201: R1602.1 U319.8(DIN)
N$3202: R1603.1 U319.6(FDIN)
N$3203: R1604.2 U319.10(DOUT)
N$3204: R1605.2 U319.7(REXT)
N$3205: LD964.K(C) U320.1(R)
N$3206: LD965.K(C) U320.2(G)
N$3207: LD966.K(C) U320.3(B)
N$3208: C322.1 R1606.1 U320.9(VDD)
N$3209: R1607.1 U320.8(DIN)
N$3210: R1604.1 R1607.2 R1613.2
N$3211: R1608.1 U320.6(FDIN)
N$3214: R1609.2 U320.10(DOUT)
N$3215: R1610.2 U320.7(REXT)
N$3216: R1609.1 R1612.2 R1618.2
N$3217: C323.1 R1611.1 U321.9(VDD)
N$3218: LD967.K(C) U321.1(R)
N$3219: LD968.K(C) U321.2(G)
N$3220: LD969.K(C) U321.3(B)
N$3221: R1612.1 U321.8(DIN)
N$3222: R1613.1 U321.6(FDIN)
N$3223: R1614.2 U321.10(DOUT)
N$3224: R1615.2 U321.7(REXT)
N$3225: LD970.K(C) U322.1(R)
N$3226: LD971.K(C) U322.2(G)
N$3227: LD972.K(C) U322.3(B)
N$3228: C324.1 R1616.1 U322.9(VDD)
N$3229: R1617.1 U322.8(DIN)
N$3230: R1614.1 R1617.2 R1623.2
N$3231: R1618.1 U322.6(FDIN)
N$3234: R1619.2 U322.10(DOUT)
N$3235: R1620.2 U322.7(REXT)
N$3236: R1619.1 R1622.2 R1628.2
N$3237: C325.1 R1621.1 U323.9(VDD)
N$3238: LD973.K(C) U323.1(R)
N$3239: LD974.K(C) U323.2(G)
N$3240: LD975.K(C) U323.3(B)
N$3241: R1622.1 U323.8(DIN)
N$3242: R1623.1 U323.6(FDIN)
N$3243: R1624.2 U323.10(DOUT)
N$3244: R1625.2 U323.7(REXT)
N$3245: LD976.K(C) U324.1(R)
N$3246: LD977.K(C) U324.2(G)
N$3247: LD978.K(C) U324.3(B)
N$3248: C326.1 R1626.1 U324.9(VDD)
N$3249: R1627.1 U324.8(DIN)
N$3251: R1628.1 U324.6(FDIN)
N$3254: R1629.2 U324.10(DOUT)
N$3255: R1630.2 U324.7(REXT)
N$3257: C327.1 R1631.1 U325.9(VDD)
N$3258: LD979.K(C) U325.1(R)
N$3259: LD980.K(C) U325.2(G)
N$3260: LD981.K(C) U325.3(B)
N$3261: R1632.1 U325.8(DIN)
N$3262: R1633.1 U325.6(FDIN)
N$3263: R1634.2 U325.10(DOUT)
N$3264: R1635.2 U325.7(REXT)
N$3265: LD982.K(C) U326.1(R)
N$3266: LD983.K(C) U326.2(G)
N$3267: LD984.K(C) U326.3(B)
N$3268: C328.1 R1636.1 U326.9(VDD)
N$3269: R1637.1 U326.8(DIN)
N$3270: R1634.1 R1637.2 R1643.2
N$3271: R1638.1 U326.6(FDIN)
N$3274: R1639.2 U326.10(DOUT)
N$3275: R1640.2 U326.7(REXT)
N$3276: R1639.1 R1642.2 R1648.2
N$3277: C329.1 R1641.1 U327.9(VDD)
N$3278: LD985.K(C) U327.1(R)
N$3279: LD986.K(C) U327.2(G)
N$3280: LD987.K(C) U327.3(B)
N$3281: R1642.1 U327.8(DIN)
N$3282: R1643.1 U327.6(FDIN)
N$3283: R1644.2 U327.10(DOUT)
N$3284: R1645.2 U327.7(REXT)
N$3285: LD988.K(C) U328.1(R)
N$3286: LD989.K(C) U328.2(G)
N$3287: LD990.K(C) U328.3(B)
N$3288: C330.1 R1646.1 U328.9(VDD)
N$3289: R1647.1 U328.8(DIN)
N$3291: R1648.1 U328.6(FDIN)
N$3294: R1649.2 U328.10(DOUT)
N$3295: R1650.2 U328.7(REXT)
N$3296: R1649.1 R1652.2 R1658.2
N$3297: C331.1 R1651.1 U329.9(VDD)
N$3298: LD991.K(C) U329.1(R)
N$3299: LD992.K(C) U329.2(G)
N$3300: LD993.K(C) U329.3(B)
N$3301: R1652.1 U329.8(DIN)
N$3302: R1653.1 U329.6(FDIN)
N$3303: R1654.2 U329.10(DOUT)
N$3304: R1655.2 U329.7(REXT)
N$3305: LD994.K(C) U330.1(R)
N$3306: LD995.K(C) U330.2(G)
N$3307: LD996.K(C) U330.3(B)
N$3308: C332.1 R1656.1 U330.9(VDD)
N$3309: R1657.1 U330.8(DIN)
N$3311: R1658.1 U330.6(FDIN)
N$3313: R1644.1 R1647.2 R1653.2
N$3314: R1659.2 U330.10(DOUT)
N$3315: R1660.2 U330.7(REXT)
N$3317: C333.1 R1661.1 U331.9(VDD)
N$3318: LD997.K(C) U331.1(R)
N$3319: LD998.K(C) U331.2(G)
N$3320: LD999.K(C) U331.3(B)
N$3321: R1662.1 U331.8(DIN)
N$3322: R1663.1 U331.6(FDIN)
N$3323: R1664.2 U331.10(DOUT)
N$3324: R1665.2 U331.7(REXT)
N$3325: LD1000.K(C) U332.1(R)
N$3326: LD1001.K(C) U332.2(G)
N$3327: LD1002.K(C) U332.3(B)
N$3328: C334.1 R1666.1 U332.9(VDD)
N$3329: R1667.1 U332.8(DIN)
N$3330: R1664.1 R1667.2 R1673.2
N$3331: R1668.1 U332.6(FDIN)
N$3334: R1669.2 U332.10(DOUT)
N$3335: R1670.2 U332.7(REXT)
N$3336: R1669.1 R1672.2 R1678.2
N$3337: C335.1 R1671.1 U333.9(VDD)
N$3338: LD1003.K(C) U333.1(R)
N$3339: LD1004.K(C) U333.2(G)
N$3340: LD1005.K(C) U333.3(B)
N$3341: R1672.1 U333.8(DIN)
N$3342: R1673.1 U333.6(FDIN)
N$3343: R1674.2 U333.10(DOUT)
N$3344: R1675.2 U333.7(REXT)
N$3345: LD1006.K(C) U334.1(R)
N$3346: LD1007.K(C) U334.2(G)
N$3347: LD1008.K(C) U334.3(B)
N$3348: C336.1 R1676.1 U334.9(VDD)
N$3349: R1677.1 U334.8(DIN)
N$3350: R1674.1 R1677.2 R1683.2
N$3351: R1678.1 U334.6(FDIN)
N$3354: R1679.2 U334.10(DOUT)
N$3355: R1680.2 U334.7(REXT)
N$3356: R1679.1 R1682.2 R1688.2
N$3357: C337.1 R1681.1 U335.9(VDD)
N$3358: LD1009.K(C) U335.1(R)
N$3359: LD1010.K(C) U335.2(G)
N$3360: LD1011.K(C) U335.3(B)
N$3361: R1682.1 U335.8(DIN)
N$3362: R1683.1 U335.6(FDIN)
N$3363: R1684.2 U335.10(DOUT)
N$3364: R1685.2 U335.7(REXT)
N$3365: LD1012.K(C) U336.1(R)
N$3366: LD1013.K(C) U336.2(G)
N$3367: LD1014.K(C) U336.3(B)
N$3368: C338.1 R1686.1 U336.9(VDD)
N$3369: R1687.1 U336.8(DIN)
N$3371: R1688.1 U336.6(FDIN)
N$3374: R1689.2 U336.10(DOUT)
N$3375: R1690.2 U336.7(REXT)
Unconnected: U313.4(W) U314.4(W) U315.4(W) U316.4(W) U317.4(W) U318.4(W) U319.4(W) U320.4(W) U321.4(W) U322.4(W) U323.4(W) U324.4(W) U325.4(W) U326.4(W) U327.4(W) U328.4(W) U329.4(W) U330.4(W) U331.4(W) U332.4(W) U333.4(W) U334.4(W) U335.4(W) U336.4(W)

### Notes on the sheet
- End Universe 2

## Sheet 15 of 17: Spare
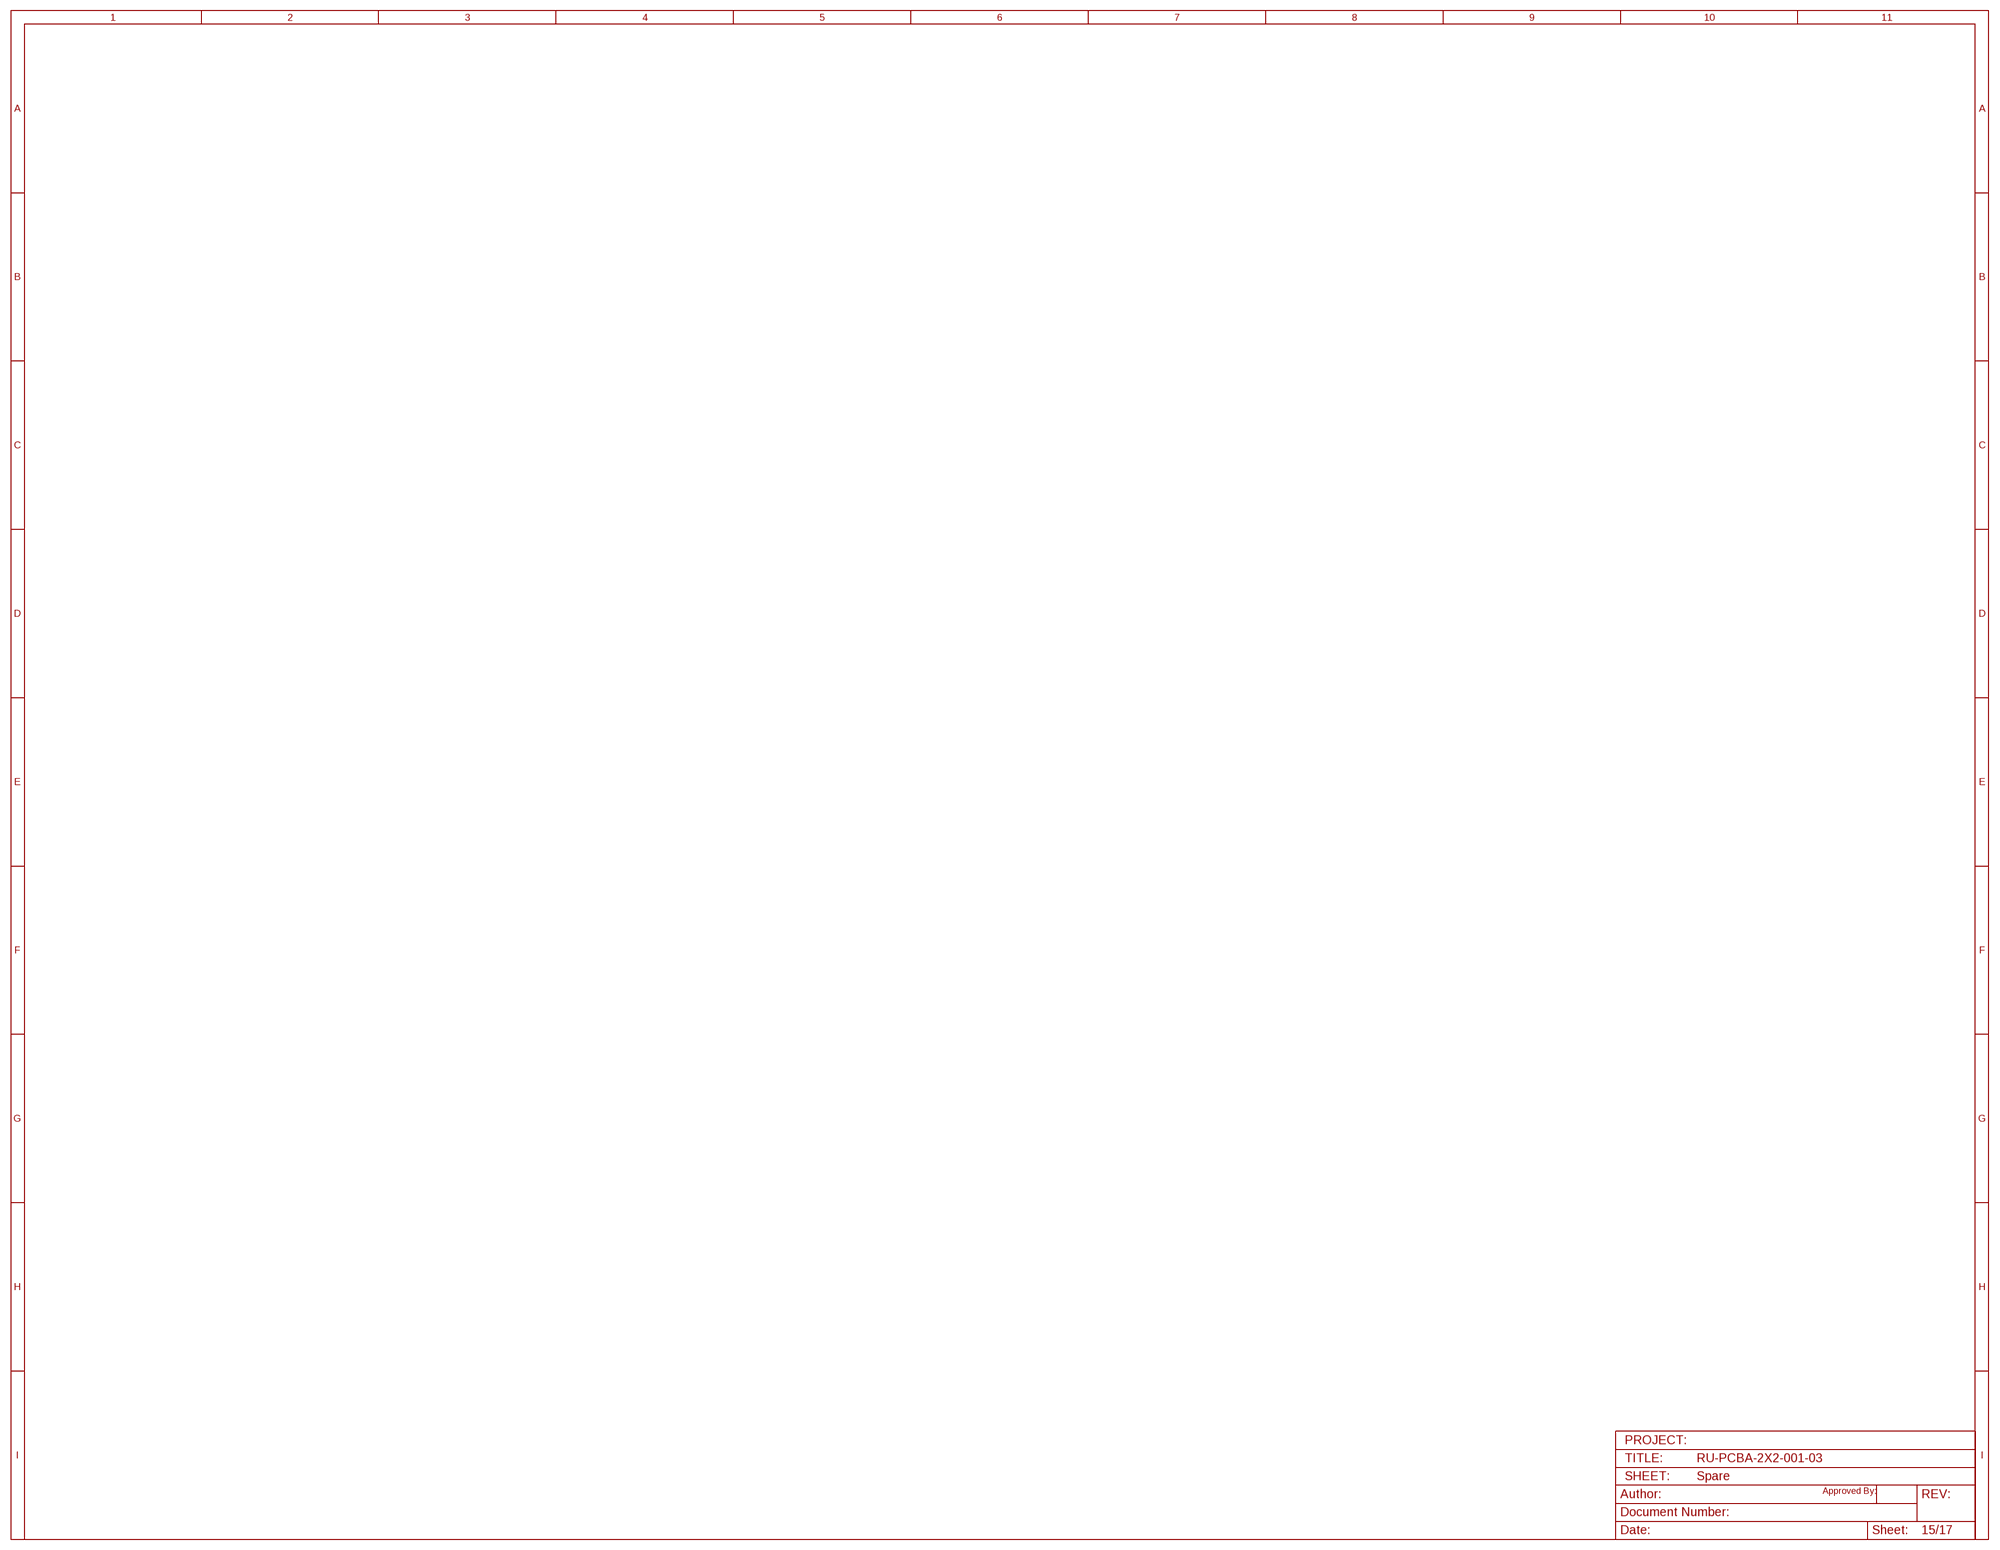
[diagram p28: schematic, sheet 15]

## Sheet 16 of 17: Revision Log
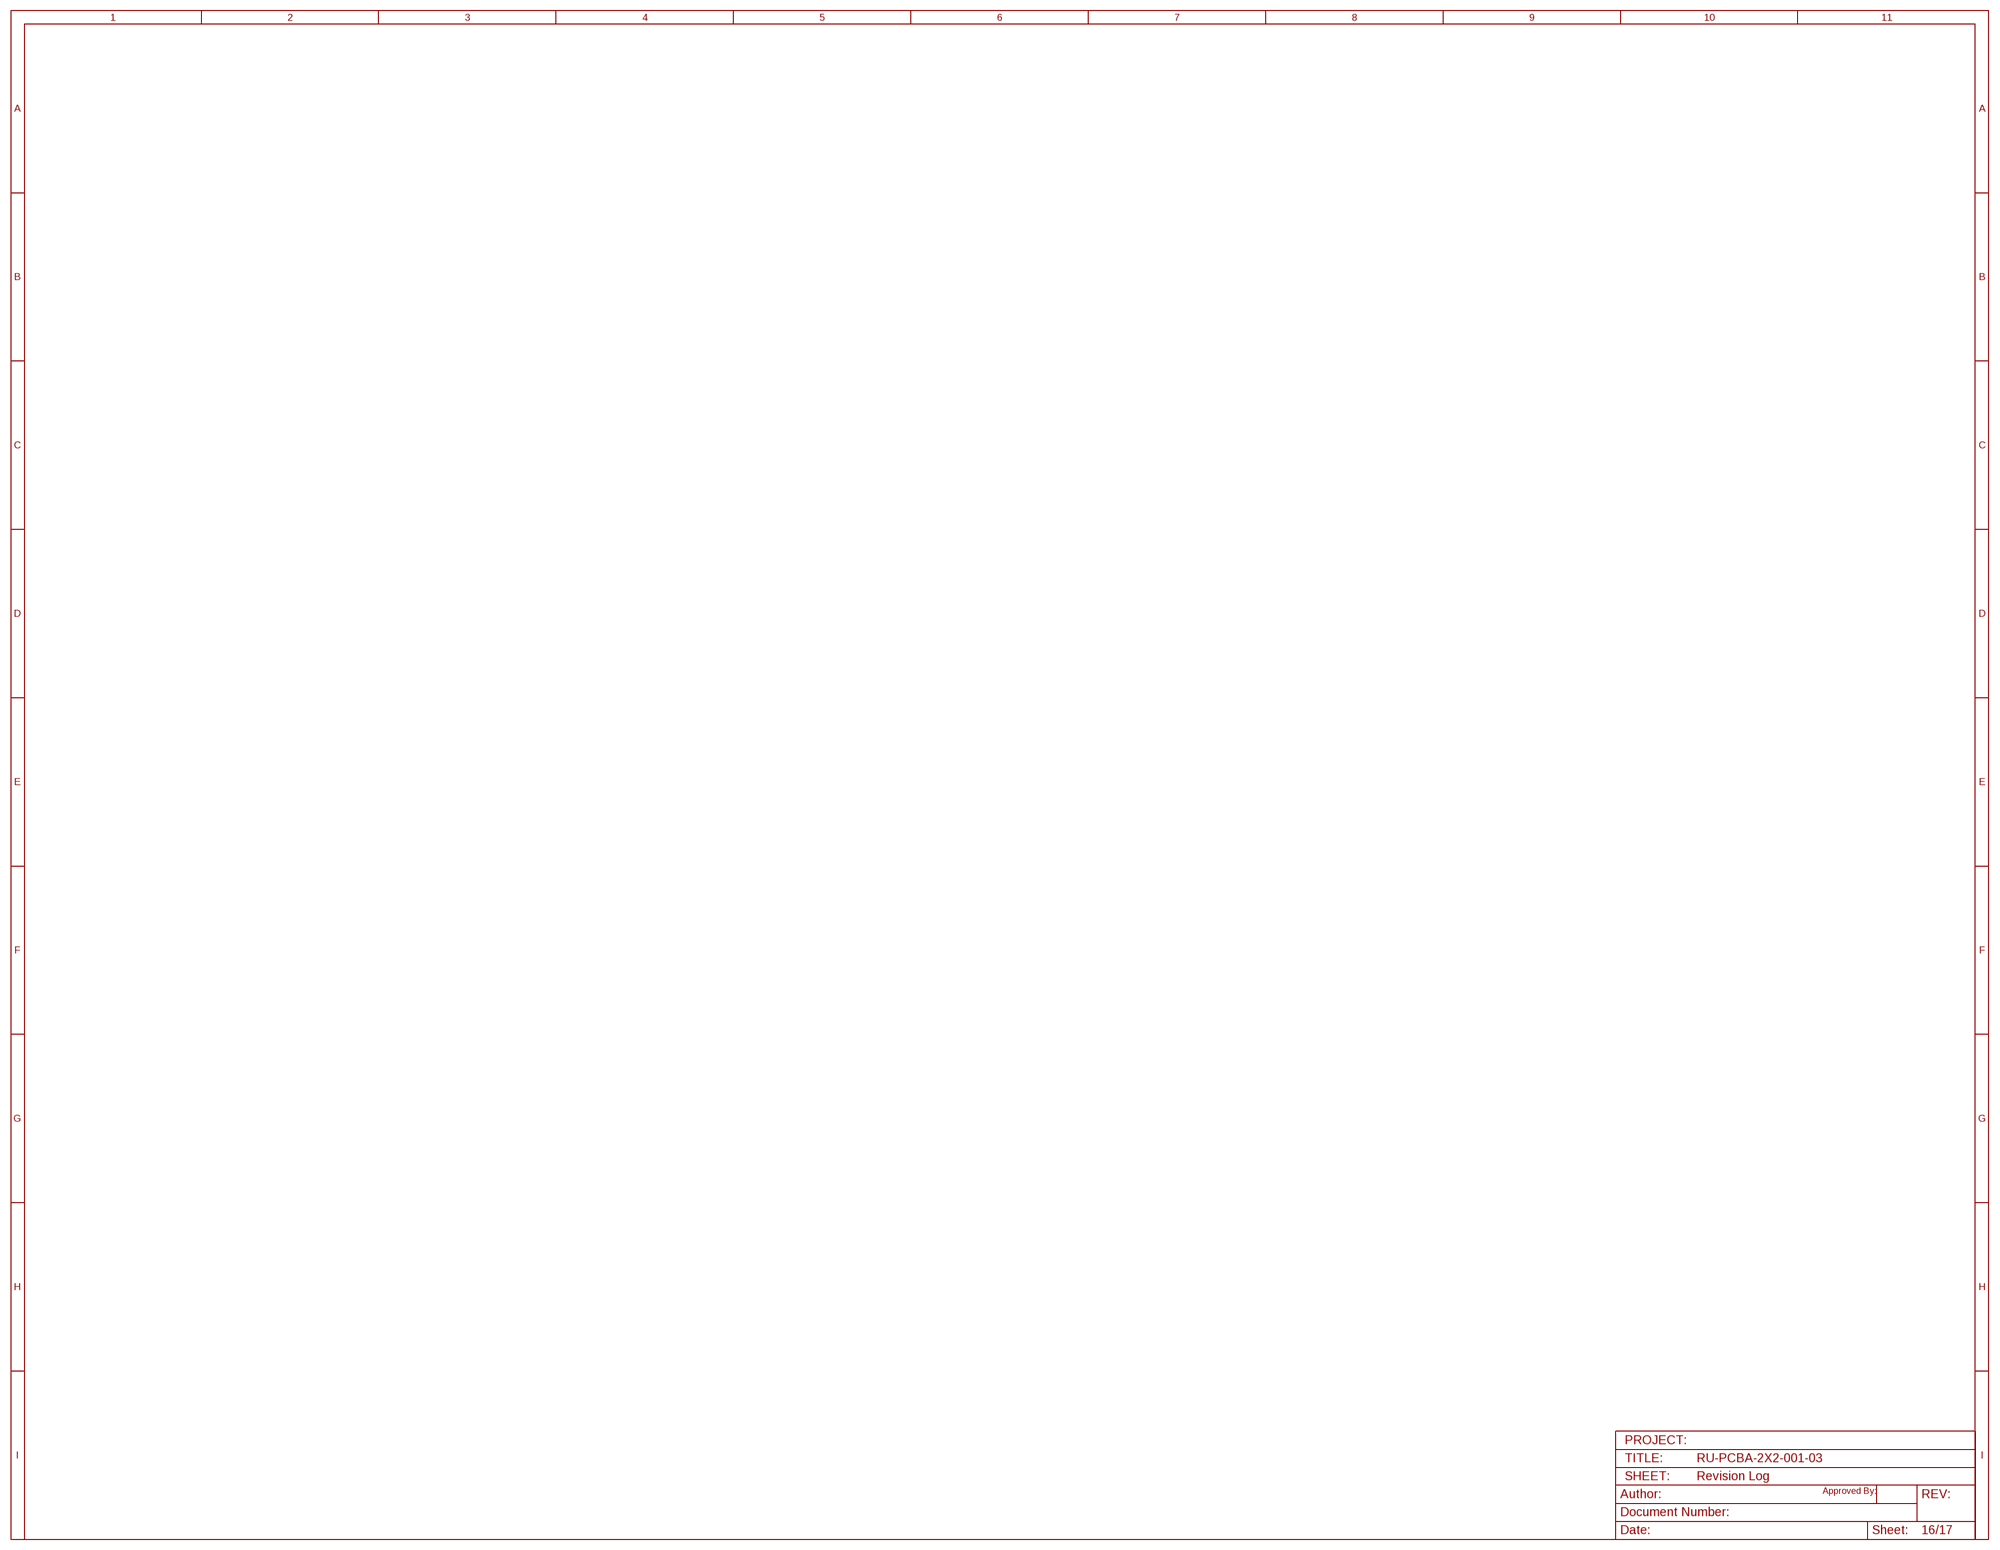
[diagram p29: schematic, sheet 16]

## Sheet 17 of 17: Hardware
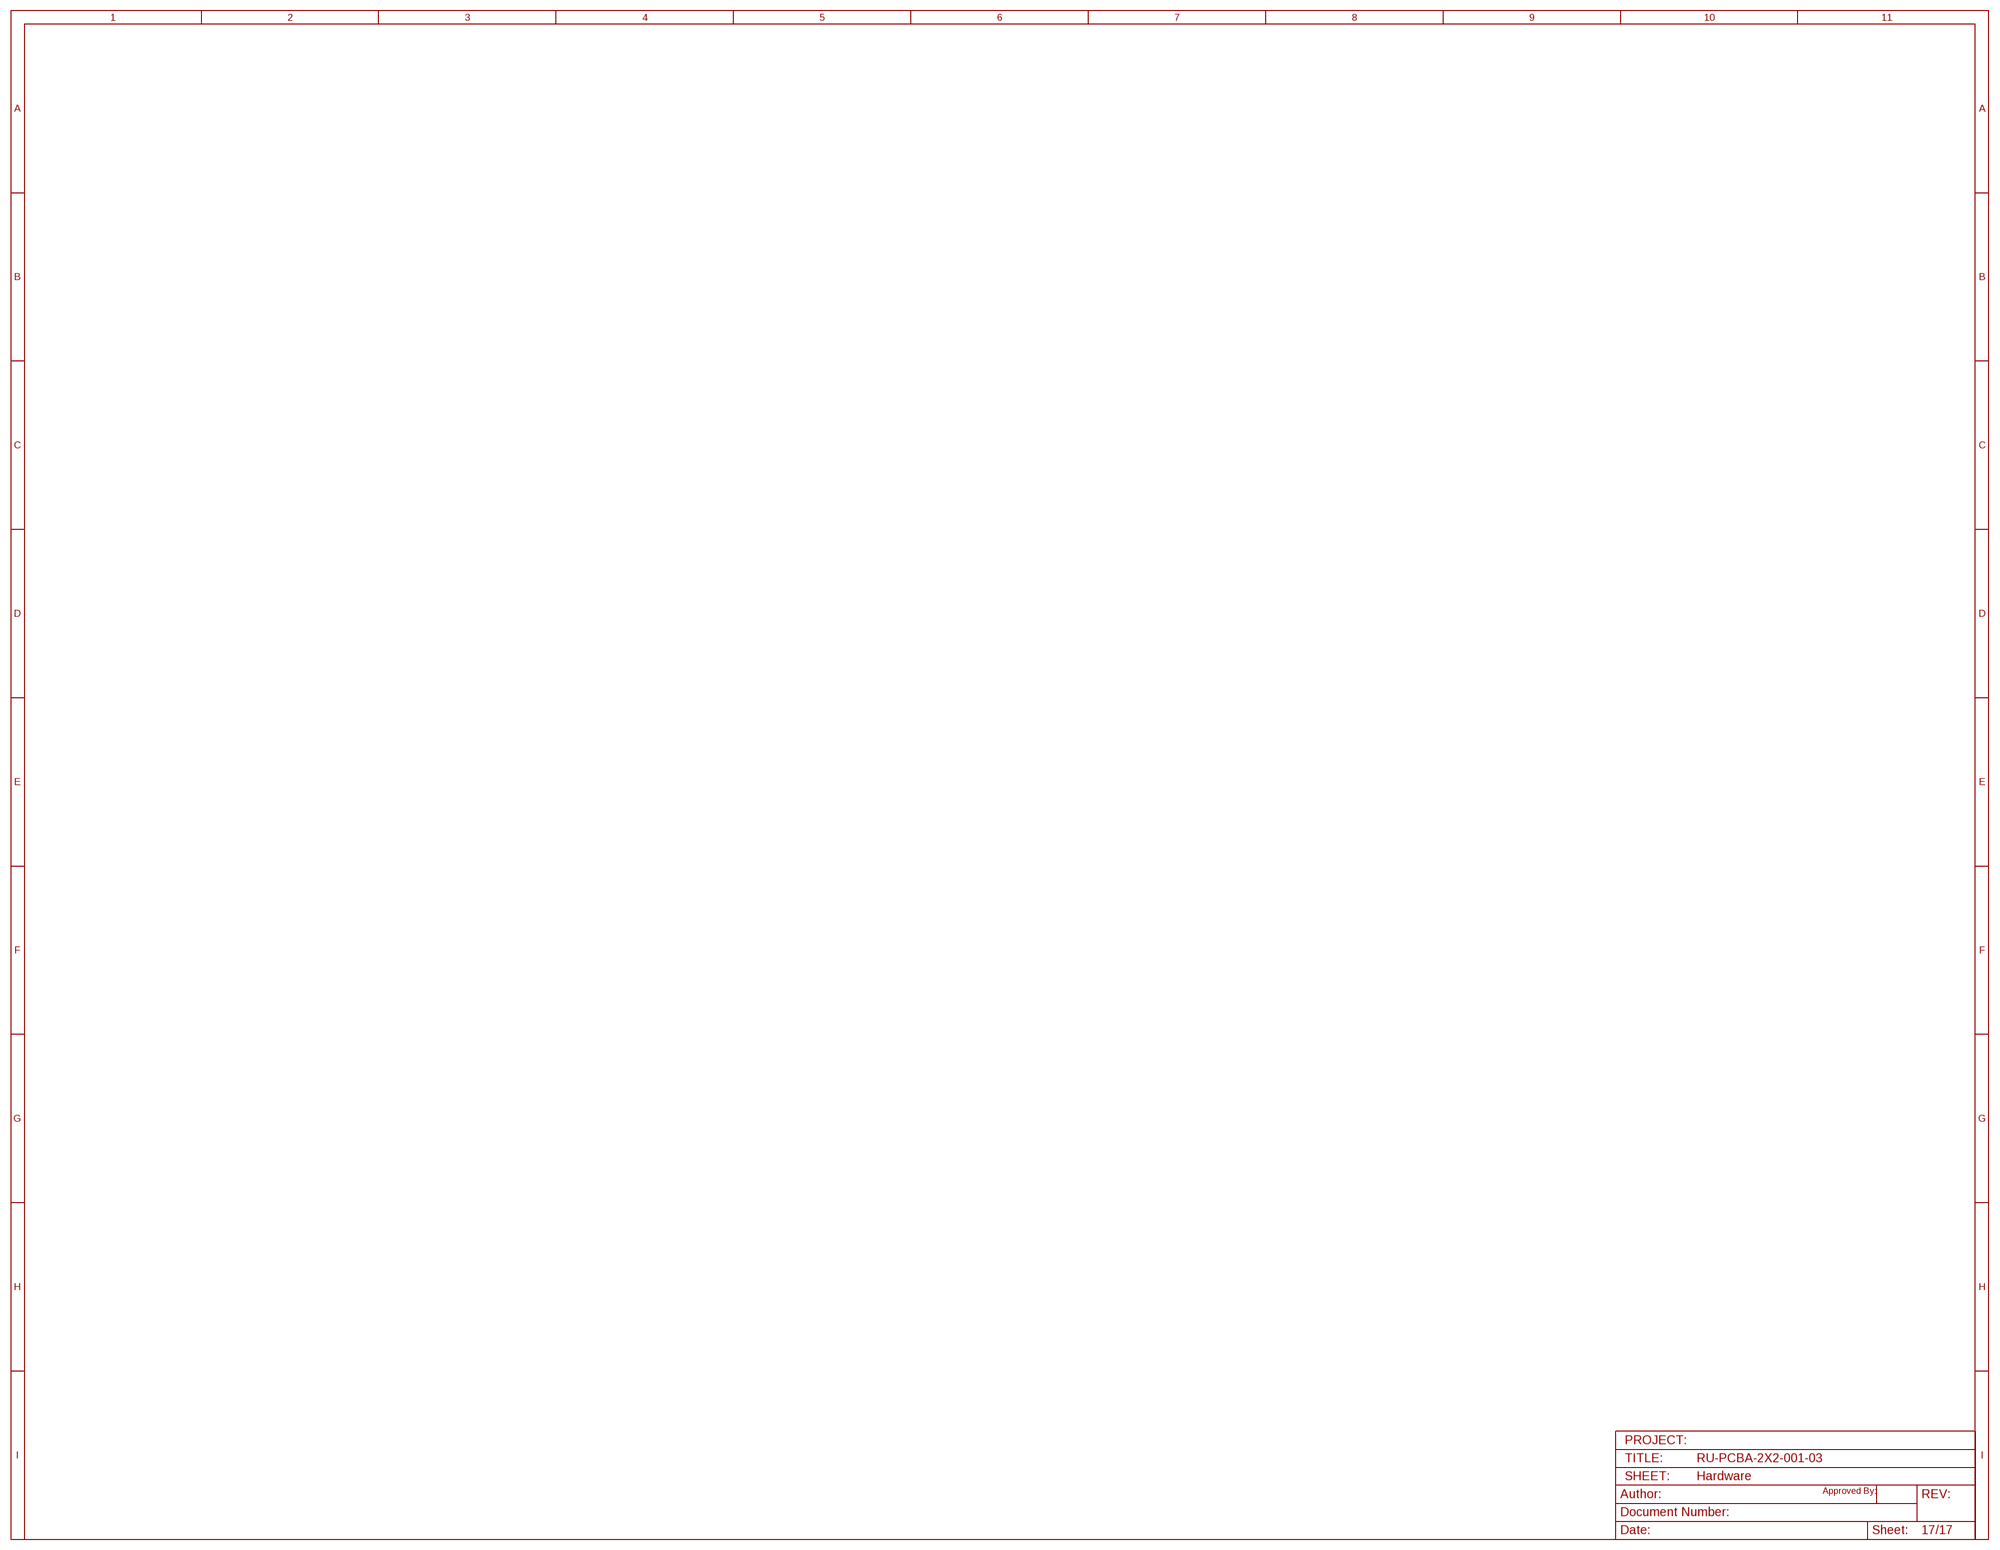
[diagram p30: schematic, sheet 17]

## Library data of the parts
C3-C338 = rcl:C-EU: CAPACITOR, European symbol; MFG: MFG_5; MPN: C_104; SPICEPREFIX: C
J1 = SamacSys_Parts:43045-0800: Micro-Fit 3.0 Right-Angle Header, 3.00mm Pitch, Dual Row, 8 Circuits, with Snap-in Plastic Peg PCB Lock Source: Datasheet <https://www.molex.com/pdm_docs/sd/430450200_sd.pdf>; DESCRIPTION: Micro-Fit 3.0 Right-Angle Header, 3.00mm Pitch, Dual Row, 8 Circuits, with Snap-in Plastic Peg PCB Lock; HEIGHT: 8.77mm; MANUFACTURER_NAME: Molex; MANUFACTURER_PART_NUMBER: 43045-0800; MOUSER_PART_NUMBER: 538-43045-0800; MOUSER_PRICE-STOCK: https://www.mouser.co.uk/ProductDetail/Molex/43045-0800?qs=MGlPTwjtJ4Z70Z3DbkGxKw%3D%3D
LD7 LD13 LD19 LD25 LD31 LD37 LD43 LD49 LD55 LD61 LD67 LD73 LD79 LD85 LD91 LD97 LD103 LD109 LD115 LD121 LD127 LD133 LD139 LD145 LD151 LD157 LD163 LD169 LD175 LD181 LD187 LD193 LD199 LD205 LD211 LD217 LD223 LD229 LD235 LD241 LD247 LD253 LD259 LD265 LD271 LD277 LD283 LD289 LD295 LD301 LD307 LD313 LD319 LD325 LD331 LD337 LD343 LD349 LD355 LD361 LD367 LD373 LD379 LD385 LD391 LD397 LD403 LD409 LD415 LD421 LD427 LD433 LD439 LD445 LD451 LD457 LD463 LD469 LD475 LD481 LD487 LD493 LD499 LD505 LD511 LD517 LD523 LD529 LD535 LD541 LD547 LD553 LD559 LD565 LD571 LD577 LD583 LD589 LD595 LD601 LD607 LD613 LD619 LD625 LD631 LD637 LD643 LD649 LD655 LD661 LD667 LD673 LD679 LD685 LD691 LD697 LD703 LD709 LD715 LD721 LD727 LD733 LD739 LD745 LD751 LD757 LD763 LD769 LD775 LD781 LD787 LD793 LD799 LD805 LD811 LD817 LD823 LD829 LD835 LD841 LD847 LD853 LD859 LD865 LD871 LD877 LD883 LD889 LD895 LD901 LD907 LD913 LD919 LD925 LD931 LD937 LD943 LD949 LD955 LD961 LD967 LD973 LD979 LD985 LD991 LD997 LD1003 LD1009 = RuPixel:5050LED; MFG: Rupixels; MPN: R_5050
LD8 LD14 LD20 LD26 LD32 LD38 LD44 LD50 LD56 LD62 LD68 LD74 LD80 LD86 LD92 LD98 LD104 LD110 LD116 LD122 LD128 LD134 LD140 LD146 LD152 LD158 LD164 LD170 LD176 LD182 LD188 LD194 LD200 LD206 LD212 LD218 LD224 LD230 LD236 LD242 LD248 LD254 LD260 LD266 LD272 LD278 LD284 LD290 LD296 LD302 LD308 LD314 LD320 LD326 LD332 LD338 LD344 LD350 LD356 LD362 LD368 LD374 LD380 LD386 LD392 LD398 LD404 LD410 LD416 LD422 LD428 LD434 LD440 LD446 LD452 LD458 LD464 LD470 LD476 LD482 LD488 LD494 LD500 LD506 LD512 LD518 LD524 LD530 LD536 LD542 LD548 LD554 LD560 LD566 LD572 LD578 LD584 LD590 LD596 LD602 LD608 LD614 LD620 LD626 LD632 LD638 LD644 LD650 LD656 LD662 LD668 LD674 LD680 LD686 LD692 LD698 LD704 LD710 LD716 LD722 LD728 LD734 LD740 LD746 LD752 LD758 LD764 LD770 LD776 LD782 LD788 LD794 LD800 LD806 LD812 LD818 LD824 LD830 LD836 LD842 LD848 LD854 LD860 LD866 LD872 LD878 LD884 LD890 LD896 LD902 LD908 LD914 LD920 LD926 LD932 LD938 LD944 LD950 LD956 LD962 LD968 LD974 LD980 LD986 LD992 LD998 LD1004 LD1010 = RuPixel:5050LED; MFG: Rupixels; MPN: G_5050
LD9 LD15 LD21 LD27 LD33 LD39 LD45 LD51 LD57 LD63 LD69 LD75 LD81 LD87 LD93 LD99 LD105 LD111 LD117 LD123 LD129 LD135 LD141 LD147 LD153 LD159 LD165 LD171 LD177 LD183 LD189 LD195 LD201 LD207 LD213 LD219 LD225 LD231 LD237 LD243 LD249 LD255 LD261 LD267 LD273 LD279 LD285 LD291 LD297 LD303 LD309 LD315 LD321 LD327 LD333 LD339 LD345 LD351 LD357 LD363 LD369 LD375 LD381 LD387 LD393 LD399 LD405 LD411 LD417 LD423 LD429 LD435 LD441 LD447 LD453 LD459 LD465 LD471 LD477 LD483 LD489 LD495 LD501 LD507 LD513 LD519 LD525 LD531 LD537 LD543 LD549 LD555 LD561 LD567 LD573 LD579 LD585 LD591 LD597 LD603 LD609 LD615 LD621 LD627 LD633 LD639 LD645 LD651 LD657 LD663 LD669 LD675 LD681 LD687 LD693 LD699 LD705 LD711 LD717 LD723 LD729 LD735 LD741 LD747 LD753 LD759 LD765 LD771 LD777 LD783 LD789 LD795 LD801 LD807 LD813 LD819 LD825 LD831 LD837 LD843 LD849 LD855 LD861 LD867 LD873 LD879 LD885 LD891 LD897 LD903 LD909 LD915 LD921 LD927 LD933 LD939 LD945 LD951 LD957 LD963 LD969 LD975 LD981 LD987 LD993 LD999 LD1005 LD1011 = RuPixel:5050LED; MFG: Rupixels; MPN: B_5050
LD10 LD16 LD22 LD28 LD34 LD40 LD46 LD52 LD58 LD64 LD70 LD76 LD82 LD88 LD94 LD100 LD106 LD112 LD118 LD124 LD130 LD136 LD142 LD148 LD154 LD160 LD166 LD172 LD178 LD184 LD190 LD196 LD202 LD208 LD214 LD220 LD226 LD232 LD238 LD244 LD250 LD256 LD262 LD268 LD274 LD280 LD286 LD292 LD298 LD304 LD310 LD316 LD322 LD328 LD334 LD340 LD346 LD352 LD358 LD364 LD370 LD376 LD382 LD388 LD394 LD400 LD406 LD412 LD418 LD424 LD430 LD436 LD442 LD448 LD454 LD460 LD466 LD472 LD478 LD484 LD490 LD496 LD502 LD508 LD514 LD520 LD526 LD532 LD538 LD544 LD550 LD556 LD562 LD568 LD574 LD580 LD586 LD592 LD598 LD604 LD610 LD616 LD622 LD628 LD634 LD640 LD646 LD652 LD658 LD664 LD670 LD676 LD682 LD688 LD694 LD700 LD706 LD712 LD718 LD724 LD730 LD736 LD742 LD748 LD754 LD760 LD766 LD772 LD778 LD784 LD790 LD796 LD802 LD808 LD814 LD820 LD826 LD832 LD838 LD844 LD850 LD856 LD862 LD868 LD874 LD880 LD886 LD892 LD898 LD904 LD910 LD916 LD922 LD928 LD934 LD940 LD946 LD952 LD958 LD964 LD970 LD976 LD982 LD988 LD994 LD1000 LD1006 LD1012 = RuPixel:5050LED; MFG: Rupixels; MPN: A_5050
LD11 LD17 LD23 LD29 LD35 LD41 LD47 LD53 LD59 LD65 LD71 LD77 LD83 LD89 LD95 LD101 LD107 LD113 LD119 LD125 LD131 LD137 LD143 LD149 LD155 LD161 LD167 LD173 LD179 LD185 LD191 LD197 LD203 LD209 LD215 LD221 LD227 LD233 LD239 LD245 LD251 LD257 LD263 LD269 LD275 LD281 LD287 LD293 LD299 LD305 LD311 LD317 LD323 LD329 LD335 LD341 LD347 LD353 LD359 LD365 LD371 LD377 LD383 LD389 LD395 LD401 LD407 LD413 LD419 LD425 LD431 LD437 LD443 LD449 LD455 LD461 LD467 LD473 LD479 LD485 LD491 LD497 LD503 LD509 LD515 LD521 LD527 LD533 LD539 LD545 LD551 LD557 LD563 LD569 LD575 LD581 LD587 LD593 LD599 LD605 LD611 LD617 LD623 LD629 LD635 LD641 LD647 LD653 LD659 LD665 LD671 LD677 LD683 LD689 LD695 LD701 LD707 LD713 LD719 LD725 LD731 LD737 LD743 LD749 LD755 LD761 LD767 LD773 LD779 LD785 LD791 LD797 LD803 LD809 LD815 LD821 LD827 LD833 LD839 LD845 LD851 LD857 LD863 LD869 LD875 LD881 LD887 LD893 LD899 LD905 LD911 LD917 LD923 LD929 LD935 LD941 LD947 LD953 LD959 LD965 LD971 LD977 LD983 LD989 LD995 LD1001 LD1007 LD1013 = RuPixel:5050LED; MFG: Rupixels; MPN: C_5050
LD12 LD18 LD24 LD30 LD36 LD42 LD48 LD54 LD60 LD66 LD72 LD78 LD84 LD90 LD96 LD102 LD108 LD114 LD120 LD126 LD132 LD138 LD144 LD150 LD156 LD162 LD168 LD174 LD180 LD186 LD192 LD198 LD204 LD210 LD216 LD222 LD228 LD234 LD240 LD246 LD252 LD258 LD264 LD270 LD276 LD282 LD288 LD294 LD300 LD306 LD312 LD318 LD324 LD330 LD336 LD342 LD348 LD354 LD360 LD366 LD372 LD378 LD384 LD390 LD396 LD402 LD408 LD414 LD420 LD426 LD432 LD438 LD444 LD450 LD456 LD462 LD468 LD474 LD480 LD486 LD492 LD498 LD504 LD510 LD516 LD522 LD528 LD534 LD540 LD546 LD552 LD558 LD564 LD570 LD576 LD582 LD588 LD594 LD600 LD606 LD612 LD618 LD624 LD630 LD636 LD642 LD648 LD654 LD660 LD666 LD672 LD678 LD684 LD690 LD696 LD702 LD708 LD714 LD720 LD726 LD732 LD738 LD744 LD750 LD756 LD762 LD768 LD774 LD780 LD786 LD792 LD798 LD804 LD810 LD816 LD822 LD828 LD834 LD840 LD846 LD852 LD858 LD864 LD870 LD876 LD882 LD888 LD894 LD900 LD906 LD912 LD918 LD924 LD930 LD936 LD942 LD948 LD954 LD960 LD966 LD972 LD978 LD984 LD990 LD996 LD1002 LD1008 LD1014 = RuPixel:5050LED; MFG: Rupixels; MPN: L_5050
R6 R16 R21 R26 R31 R36 R41 R46 R51 R56 R61 R66 R71 R76 R81 R86 R91 R96 R101 R106 R111 R116 R121 R126 R131 R136 R141 R146 R151 R156 R161 R166 R171 R176 R181 R186 R191 R196 R201 R206 R211 R216 R221 R226 R231 R236 R241 R246 R251 R256 R261 R266 R271 R276 R281 R286 R291 R296 R301 R306 R311 R316 R321 R326 R331 R336 R341 R346 R351 R356 R361 R366 R371 R376 R381 R386 R391 R396 R401 R406 R411 R416 R421 R426 R431 R436 R441 R446 R451 R456 R461 R466 R471 R476 R481 R486 R491 R496 R501 R506 R511 R516 R521 R526 R531 R536 R541 R546 R551 R556 R561 R566 R571 R576 R581 R586 R591 R596 R601 R606 R611 R616 R621 R626 R631 R636 R641 R646 R651 R656 R661 R666 R671 R676 R681 R686 R691 R696 R701 R706 R711 R716 R721 R726 R731 R736 R741 R746 R751 R756 R761 R766 R771 R776 R781 R786 R791 R796 R801 R806 R811 R816 R821 R826 R831 R836 R841 R846 R851 R856 R861 R866 R871 R876 R881 R886 R891 R896 R901 R906 R911 R916 R921 R926 R931 R936 R941 R946 R951 R956 R961 R966 R971 R976 R981 R986 R991 R996 R1001 R1006 R1011 R1016 R1021 R1026 R1031 R1036 R1041 R1046 R1051 R1056 R1061 R1066 R1071 R1076 R1081 R1086 R1091 R1096 R1101 R1106 R1111 R1116 R1121 R1126 R1131 R1136 R1141 R1146 R1151 R1156 R1161 R1166 R1171 R1176 R1181 R1186 R1191 R1196 R1201 R1206 R1211 R1216 R1221 R1226 R1231 R1236 R1241 R1246 R1251 R1256 R1261 R1266 R1271 R1276 R1281 R1286 R1291 R1296 R1301 R1306 R1311 R1316 R1321 R1326 R1331 R1336 R1341 R1346 R1351 R1356 R1361 R1366 R1371 R1376 R1381 R1386 R1391 R1396 R1401 R1406 R1411 R1416 R1421 R1426 R1431 R1436 R1441 R1446 R1451 R1456 R1461 R1466 R1471 R1476 R1481 R1486 R1491 R1496 R1501 R1506 R1511 R1516 R1521 R1526 R1531 R1536 R1541 R1546 R1551 R1556 R1561 R1566 R1571 R1576 R1581 R1586 R1591 R1596 R1601 R1606 R1611 R1616 R1621 R1626 R1631 R1636 R1641 R1646 R1651 R1656 R1661 R1666 R1671 R1676 R1681 R1686 = rcl:R-US_: RESISTOR, American symbol; MFG: MFG_2; MPN: R_VDD; SPICEPREFIX: R
R12 R13 R17 R18 R22 R23 R27 R28 R32 R33 R37 R38 R42 R43 R47 R48 R52 R53 R57 R58 R62 R63 R67 R68 R72 R73 R77 R78 R82 R83 R87 R88 R92 R93 R97 R98 R102 R103 R107 R108 R112 R113 R117 R118 R122 R123 R127 R128 R132 R133 R137 R138 R142 R143 R147 R148 R152 R153 R157 R158 R162 R163 R167 R168 R172 R173 R177 R178 R182 R183 R187 R188 R192 R193 R197 R198 R202 R203 R207 R208 R212 R213 R217 R218 R222 R223 R227 R228 R232 R233 R237 R238 R242 R243 R247 R248 R252 R253 R257 R258 R262 R263 R267 R268 R272 R273 R277 R278 R282 R283 R287 R288 R292 R293 R297 R298 R302 R303 R307 R308 R312 R313 R317 R318 R322 R323 R327 R328 R332 R333 R337 R338 R342 R343 R347 R348 R352 R353 R357 R358 R362 R363 R367 R368 R372 R373 R377 R378 R382 R383 R387 R388 R392 R393 R397 R398 R402 R403 R407 R408 R412 R413 R417 R418 R422 R423 R427 R428 R432 R433 R437 R438 R442 R443 R447 R448 R452 R453 R457 R458 R462 R463 R467 R468 R472 R473 R477 R478 R482 R483 R487 R488 R492 R493 R497 R498 R502 R503 R507 R508 R512 R513 R517 R518 R522 R523 R527 R528 R532 R533 R537 R538 R542 R543 R547 R548 R552 R553 R557 R558 R562 R563 R567 R568 R572 R573 R577 R578 R582 R583 R587 R588 R592 R593 R597 R598 R602 R603 R607 R608 R612 R613 R617 R618 R622 R623 R627 R628 R632 R633 R637 R638 R642 R643 R647 R648 R652 R653 R657 R658 R662 R663 R667 R668 R672 R673 R677 R678 R682 R683 R687 R688 R692 R693 R697 R698 R702 R703 R707 R708 R712 R713 R717 R718 R722 R723 R727 R728 R732 R733 R737 R738 R742 R743 R747 R748 R752 R753 R757 R758 R762 R763 R767 R768 R772 R773 R777 R778 R782 R783 R787 R788 R792 R793 R797 R798 R802 R803 R807 R808 R812 R813 R817 R818 R822 R823 R827 R828 R832 R833 R837 R838 R842 R843 R847 R848 R852 R853 R857 R858 R862 R863 R867 R868 R872 R873 R877 R878 R882 R883 R887 R888 R892 R893 R897 R898 R902 R903 R907 R908 R912 R913 R917 R918 R922 R923 R927 R928 R932 R933 R937 R938 R942 R943 R947 R948 R952 R953 R957 R958 R962 R963 R967 R968 R972 R973 R977 R978 R982 R983 R987 R988 R992 R993 R997 R998 R1002 R1003 R1007 R1008 R1012 R1013 R1017 R1018 R1022 R1023 R1027 R1028 R1032 R1033 R1037 R1038 R1042 R1043 R1047 R1048 R1052 R1053 R1057 R1058 R1062 R1063 R1067 R1068 R1072 R1073 R1077 R1078 R1082 R1083 R1087 R1088 R1092 R1093 R1097 R1098 R1102 R1103 R1107 R1108 R1112 R1113 R1117 R1118 R1122 R1123 R1127 R1128 R1132 R1133 R1137 R1138 R1142 R1143 R1147 R1148 R1152 R1153 R1157 R1158 R1162 R1163 R1167 R1168 R1172 R1173 R1177 R1178 R1182 R1183 R1187 R1188 R1192 R1193 R1197 R1198 R1202 R1203 R1207 R1208 R1212 R1213 R1217 R1218 R1222 R1223 R1227 R1228 R1232 R1233 R1237 R1238 R1242 R1243 R1247 R1248 R1252 R1253 R1257 R1258 R1262 R1263 R1267 R1268 R1272 R1273 R1277 R1278 R1282 R1283 R1287 R1288 R1292 R1293 R1297 R1298 R1302 R1303 R1307 R1308 R1312 R1313 R1317 R1318 R1322 R1323 R1327 R1328 R1332 R1333 R1337 R1338 R1342 R1343 R1347 R1348 R1352 R1353 R1357 R1358 R1362 R1363 R1367 R1368 R1372 R1373 R1377 R1378 R1382 R1383 R1387 R1388 R1392 R1393 R1397 R1398 R1402 R1403 R1407 R1408 R1412 R1413 R1417 R1418 R1422 R1423 R1427 R1428 R1432 R1433 R1437 R1438 R1442 R1443 R1447 R1448 R1452 R1453 R1457 R1458 R1462 R1463 R1467 R1468 R1472 R1473 R1477 R1478 R1482 R1483 R1487 R1488 R1492 R1493 R1497 R1498 R1502 R1503 R1507 R1508 R1512 R1513 R1517 R1518 R1522 R1523 R1527 R1528 R1532 R1533 R1537 R1538 R1542 R1543 R1547 R1548 R1552 R1553 R1557 R1558 R1562 R1563 R1567 R1568 R1572 R1573 R1577 R1578 R1582 R1583 R1587 R1588 R1592 R1593 R1597 R1598 R1602 R1603 R1607 R1608 R1612 R1613 R1617 R1618 R1622 R1623 R1627 R1628 R1632 R1633 R1637 R1638 R1642 R1643 R1647 R1648 R1652 R1653 R1657 R1658 R1662 R1663 R1667 R1668 R1672 R1673 R1677 R1678 R1682 R1683 R1687 R1688 = rcl:R-US_: RESISTOR, American symbol; MFG: MFG_1; MPN: R_500; SPICEPREFIX: R
R14 R19 R24 R29 R34 R39 R44 R49 R54 R59 R64 R69 R74 R79 R84 R89 R94 R99 R104 R109 R114 R119 R124 R129 R134 R139 R144 R149 R154 R159 R164 R169 R174 R179 R184 R189 R194 R199 R204 R209 R214 R219 R224 R229 R234 R239 R244 R249 R254 R259 R264 R269 R274 R279 R284 R289 R294 R299 R304 R309 R314 R319 R324 R329 R334 R339 R344 R349 R354 R359 R364 R369 R374 R379 R384 R389 R394 R399 R404 R409 R414 R419 R424 R429 R434 R439 R444 R449 R454 R459 R464 R469 R474 R479 R484 R489 R494 R499 R504 R509 R514 R519 R524 R529 R534 R539 R544 R549 R554 R559 R564 R569 R574 R579 R584 R589 R594 R599 R604 R609 R614 R619 R624 R629 R634 R639 R644 R649 R654 R659 R664 R669 R674 R679 R684 R689 R694 R699 R704 R709 R714 R719 R724 R729 R734 R739 R744 R749 R754 R759 R764 R769 R774 R779 R784 R789 R794 R799 R804 R809 R814 R819 R824 R829 R834 R839 R844 R849 R854 R859 R864 R869 R874 R879 R884 R889 R894 R899 R904 R909 R914 R919 R924 R929 R934 R939 R944 R949 R954 R959 R964 R969 R974 R979 R984 R989 R994 R999 R1004 R1009 R1014 R1019 R1024 R1029 R1034 R1039 R1044 R1049 R1054 R1059 R1064 R1069 R1074 R1079 R1084 R1089 R1094 R1099 R1104 R1109 R1114 R1119 R1124 R1129 R1134 R1139 R1144 R1149 R1154 R1159 R1164 R1169 R1174 R1179 R1184 R1189 R1194 R1199 R1204 R1209 R1214 R1219 R1224 R1229 R1234 R1239 R1244 R1249 R1254 R1259 R1264 R1269 R1274 R1279 R1284 R1289 R1294 R1299 R1304 R1309 R1314 R1319 R1324 R1329 R1334 R1339 R1344 R1349 R1354 R1359 R1364 R1369 R1374 R1379 R1384 R1389 R1394 R1399 R1404 R1409 R1414 R1419 R1424 R1429 R1434 R1439 R1444 R1449 R1454 R1459 R1464 R1469 R1474 R1479 R1484 R1489 R1494 R1499 R1504 R1509 R1514 R1519 R1524 R1529 R1534 R1539 R1544 R1549 R1554 R1559 R1564 R1569 R1574 R1579 R1584 R1589 R1594 R1599 R1604 R1609 R1614 R1619 R1624 R1629 R1634 R1639 R1644 R1649 R1654 R1659 R1664 R1669 R1674 R1679 R1684 R1689 = rcl:R-US_: RESISTOR, American symbol; MFG: MFG_3; MPN: R_120; SPICEPREFIX: R
R15 R20 R25 R30 R35 R40 R45 R50 R55 R60 R65 R70 R75 R80 R85 R90 R95 R100 R105 R110 R115 R120 R125 R130 R135 R140 R145 R150 R155 R160 R165 R170 R175 R180 R185 R190 R195 R200 R205 R210 R215 R220 R225 R230 R235 R240 R245 R250 R255 R260 R265 R270 R275 R280 R285 R290 R295 R300 R305 R310 R315 R320 R325 R330 R335 R340 R345 R350 R355 R360 R365 R370 R375 R380 R385 R390 R395 R400 R405 R410 R415 R420 R425 R430 R435 R440 R445 R450 R455 R460 R465 R470 R475 R480 R485 R490 R495 R500 R505 R510 R515 R520 R525 R530 R535 R540 R545 R550 R555 R560 R565 R570 R575 R580 R585 R590 R595 R600 R605 R610 R615 R620 R625 R630 R635 R640 R645 R650 R655 R660 R665 R670 R675 R680 R685 R690 R695 R700 R705 R710 R715 R720 R725 R730 R735 R740 R745 R750 R755 R760 R765 R770 R775 R780 R785 R790 R795 R800 R805 R810 R815 R820 R825 R830 R835 R840 R845 R850 R855 R860 R865 R870 R875 R880 R885 R890 R895 R900 R905 R910 R915 R920 R925 R930 R935 R940 R945 R950 R955 R960 R965 R970 R975 R980 R985 R990 R995 R1000 R1005 R1010 R1015 R1020 R1025 R1030 R1035 R1040 R1045 R1050 R1055 R1060 R1065 R1070 R1075 R1080 R1085 R1090 R1095 R1100 R1105 R1110 R1115 R1120 R1125 R1130 R1135 R1140 R1145 R1150 R1155 R1160 R1165 R1170 R1175 R1180 R1185 R1190 R1195 R1200 R1205 R1210 R1215 R1220 R1225 R1230 R1235 R1240 R1245 R1250 R1255 R1260 R1265 R1270 R1275 R1280 R1285 R1290 R1295 R1300 R1305 R1310 R1315 R1320 R1325 R1330 R1335 R1340 R1345 R1350 R1355 R1360 R1365 R1370 R1375 R1380 R1385 R1390 R1395 R1400 R1405 R1410 R1415 R1420 R1425 R1430 R1435 R1440 R1445 R1450 R1455 R1460 R1465 R1470 R1475 R1480 R1485 R1490 R1495 R1500 R1505 R1510 R1515 R1520 R1525 R1530 R1535 R1540 R1545 R1550 R1555 R1560 R1565 R1570 R1575 R1580 R1585 R1590 R1595 R1600 R1605 R1610 R1615 R1620 R1625 R1630 R1635 R1640 R1645 R1650 R1655 R1660 R1665 R1670 R1675 R1680 R1685 R1690 = rcl:R-US_: RESISTOR, American symbol; MFG: MFG_4; MPN: R_EXT; SPICEPREFIX: R
U1-U336 = RuPixel:UCS7604: Four Channel Pixel Driver; MFG: UCS Microelectronics; MPN: UCS7604